# Altium project DATALOGER_final.PrjPcb (part 1 of 2)
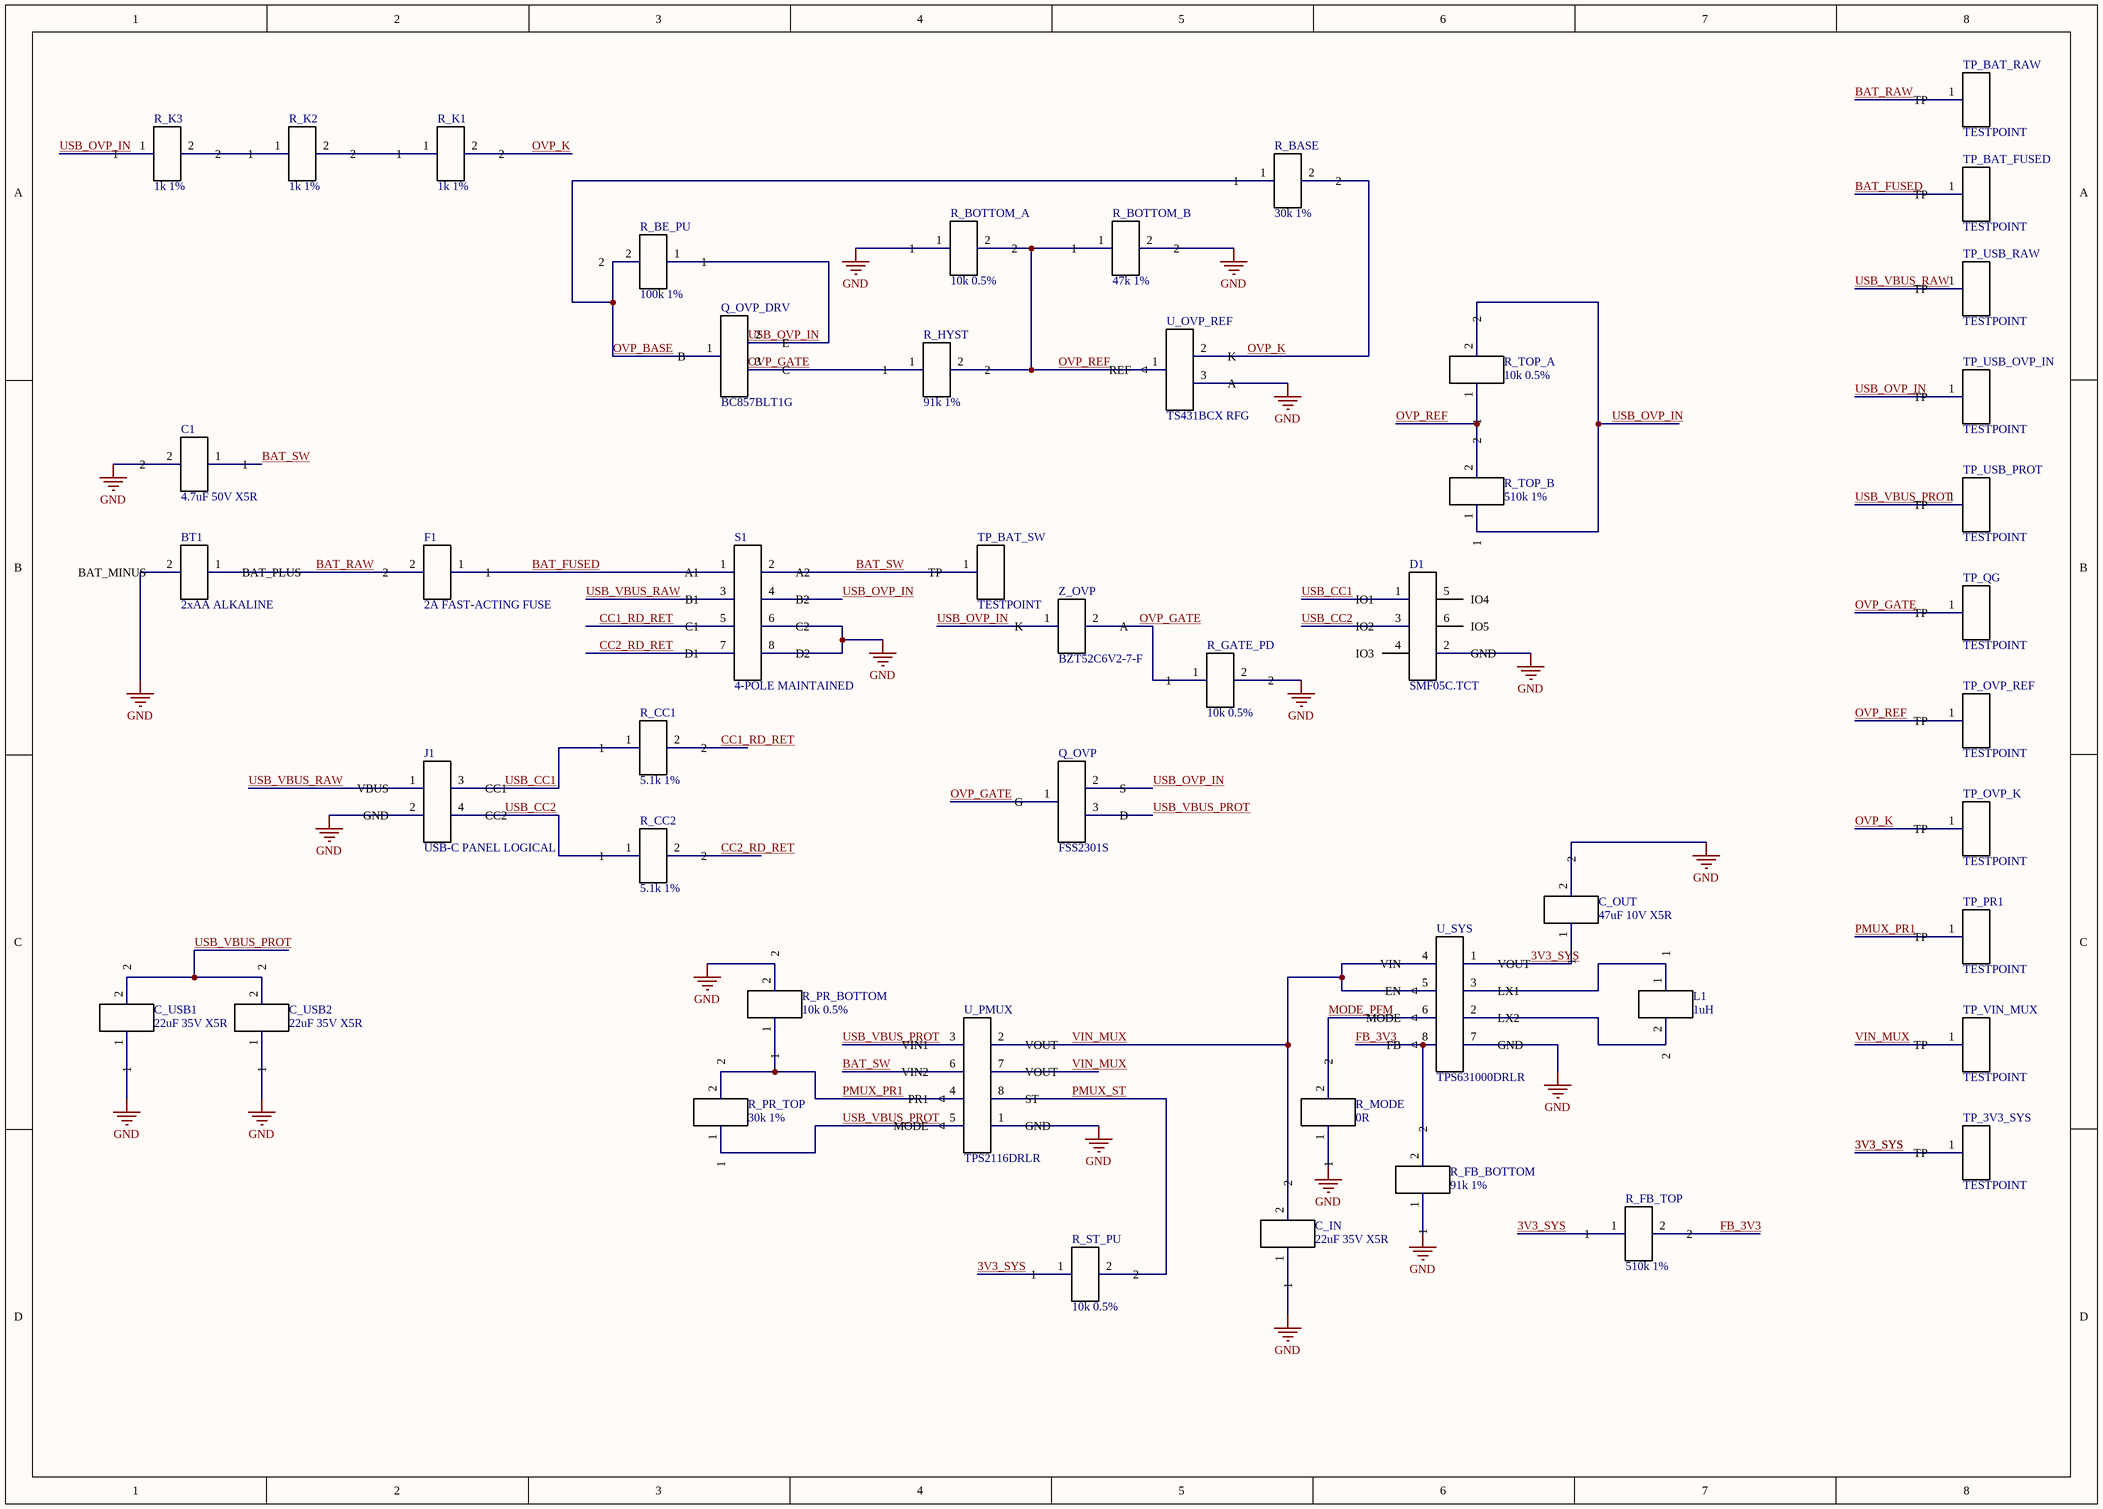
[diagram p0: 01_POWER.SchDoc]
7 sheets, 133 parts. Net scope: global (net labels, ports and power ports of the same name join across sheets).
Board file: DATALOGER_RevA.PcbDoc
Sheets:
  01_POWER.SchDoc
  02_MCU_CORE.SchDoc
  03_MICROSD.SchDoc
  04_NAVIGATION.SchDoc
  05_RTC.SchDoc
  06_OLED_SHT3X.SchDoc
  07_EXPANSION.SchDoc

## Sheet 01_POWER.SchDoc
size A3; SheetNumber: 1; SheetTotal: 7

### Parts
BT1  2xAA ALKALINE  [JST_XH_B2B_XH_A_2P_THT]
C1  4.7uF 50V X5R  [TDK_C2012_0805_CAP_2P]
C_IN  22uF 35V X5R  [TDK_C2012_0805_CAP_2P]
C_OUT  47uF 10V X5R  [TDK_C2012_0805_CAP_2P]
C_USB1  22uF 35V X5R  [TDK_C2012_0805_CAP_2P]
C_USB2  22uF 35V X5R  [TDK_C2012_0805_CAP_2P]
D1  SMF05C.TCT  [SEMTECH_SC70_6L_SMF05C]
F1  2A FAST-ACTING FUSE  [JDT_JFC2410FS_2P]
J1  USB-C PANEL LOGICAL  [JST_XH_B4B_XH_A_4P_THT]
L1  1uH  [MURATA_DFE322512F_2P]
Q_OVP  FSS2301S  [FOSAN_SOT23_FSS2301S_3P]
Q_OVP_DRV  BC857BLT1G  [ONSEMI_CASE318_SOT23_3P]
R_BASE  30k 1%  [RES_0603_SHARED_2P]
R_BE_PU  100k 1%  [RES_0603_SHARED_2P]
R_BOTTOM_A  10k 0.5%  [RES_0805_SHARED_2P]
R_BOTTOM_B  47k 1%  [RES_0603_SHARED_2P]
R_CC1  5.1k 1%  [RES_0603_SHARED_2P]
R_CC2  5.1k 1%  [RES_0603_SHARED_2P]
R_FB_BOTTOM  91k 1%  [RES_0805_SHARED_2P]
R_FB_TOP  510k 1%  [UNIROYAL_RES_1206_2P]
R_GATE_PD  10k 0.5%  [RES_0805_SHARED_2P]
R_HYST  91k 1%  [RES_0805_SHARED_2P]
R_K1  1k 1%  [RES_0805_SHARED_2P]
R_K2  1k 1%  [RES_0805_SHARED_2P]
R_K3  1k 1%  [RES_0805_SHARED_2P]
R_MODE  0R  [RES_0603_SHARED_2P]
R_PR_BOTTOM  10k 0.5%  [RES_0805_SHARED_2P]
R_PR_TOP  30k 1%  [RES_0603_SHARED_2P]
R_ST_PU  10k 0.5%  [RES_0805_SHARED_2P]
R_TOP_A  10k 0.5%  [RES_0805_SHARED_2P]
R_TOP_B  510k 1%  [UNIROYAL_RES_1206_2P]
S1  4-POLE MAINTAINED  [JST_XH_B8B_XH_A_8P_THT]
TP_3V3_SYS  TESTPOINT  [TESTPOINT_GENERIC_1P5MM]
TP_BAT_FUSED  TESTPOINT  [TESTPOINT_GENERIC_1P5MM]
TP_BAT_RAW  TESTPOINT  [TESTPOINT_GENERIC_1P5MM]
TP_BAT_SW  TESTPOINT  [TESTPOINT_GENERIC_1P5MM]
TP_OVP_K  TESTPOINT  [TESTPOINT_GENERIC_1P5MM]
TP_OVP_REF  TESTPOINT  [TESTPOINT_GENERIC_1P5MM]
TP_PR1  TESTPOINT  [TESTPOINT_GENERIC_1P5MM]
TP_QG  TESTPOINT  [TESTPOINT_GENERIC_1P5MM]
TP_USB_OVP_IN  TESTPOINT  [TESTPOINT_GENERIC_1P5MM]
TP_USB_PROT  TESTPOINT  [TESTPOINT_GENERIC_1P5MM]
TP_USB_RAW  TESTPOINT  [TESTPOINT_GENERIC_1P5MM]
TP_VIN_MUX  TESTPOINT  [TESTPOINT_GENERIC_1P5MM]
U_OVP_REF  TS431BCX RFG  [TSC_SOT23_TS431_3P]
U_PMUX  TPS2116DRLR  [TI_DRL0008A_8P]
U_SYS  TPS631000DRLR  [TI_DRL0008A_8P]
Z_OVP  BZT52C6V2-7-F  [DIODES_SOD123_2P]

### Nets
GND: BT1.2(BAT_MINUS) C1.2 C_IN.1 C_OUT.2 C_USB1.1 C_USB2.1 D1.2(GND) J1.2(GND) R_BOTTOM_A.1 R_BOTTOM_B.2 R_FB_BOTTOM.1 R_GATE_PD.2 R_MODE.1 R_PR_BOTTOM.2 S1.6(C2) S1.8(D2) U_OVP_REF.3(A) U_PMUX.1(GND) U_SYS.7(GND)
3V3_SYS: C_OUT.1 R_FB_TOP.1 R_ST_PU.1 TP_3V3_SYS.1(TP) U_SYS.1(VOUT)
BAT_FUSED: F1.1 S1.1(A1) TP_BAT_FUSED.1(TP)
BAT_RAW: BT1.1(BAT_PLUS) F1.2 TP_BAT_RAW.1(TP)
BAT_SW: C1.1 S1.2(A2) TP_BAT_SW.1(TP) U_PMUX.6(VIN2)
CC1_RD_RET: R_CC1.2 S1.5(C1)
CC2_RD_RET: R_CC2.2 S1.7(D1)
FB_3V3: R_FB_BOTTOM.2 R_FB_TOP.2 U_SYS.8(FB)
MODE_PFM: R_MODE.2 U_SYS.6(MODE)
OVP_BASE: Q_OVP_DRV.1(B) R_BASE.1 R_BE_PU.2
OVP_GATE: Q_OVP.1(G) Q_OVP_DRV.3(C) R_GATE_PD.1 R_HYST.1 TP_QG.1(TP) Z_OVP.2(A)
OVP_K: R_BASE.2 R_K1.2 TP_OVP_K.1(TP) U_OVP_REF.2(K)
OVP_REF: R_BOTTOM_A.2 R_BOTTOM_B.1 R_HYST.2 R_TOP_A.1 R_TOP_B.2 TP_OVP_REF.1(TP) U_OVP_REF.1(REF)
PMUX_PR1: R_PR_BOTTOM.1 R_PR_TOP.2 TP_PR1.1(TP) U_PMUX.4(PR1)
PMUX_ST: R_ST_PU.2 U_PMUX.8(ST)
USB_CC1: D1.1(IO1) J1.3(CC1) R_CC1.1
USB_CC2: D1.3(IO2) J1.4(CC2) R_CC2.1
USB_OVP_IN: Q_OVP.2(S) Q_OVP_DRV.2(E) R_BE_PU.1 R_K3.1 R_TOP_A.2 R_TOP_B.1 S1.4(B2) TP_USB_OVP_IN.1(TP) Z_OVP.1(K)
USB_VBUS_PROT: C_USB1.2 C_USB2.2 Q_OVP.3(D) R_PR_TOP.1 TP_USB_PROT.1(TP) U_PMUX.3(VIN1) U_PMUX.5(MODE)
USB_VBUS_RAW: J1.1(VBUS) S1.3(B1) TP_USB_RAW.1(TP)
VIN_MUX: C_IN.2 TP_VIN_MUX.1(TP) U_PMUX.2(VOUT) U_PMUX.7(VOUT) U_SYS.4(VIN) U_SYS.5(EN)
NetL1_1: L1.1 U_SYS.3(LX1)
NetL1_2: L1.2 U_SYS.2(LX2)
NetR_K1_1: R_K1.1 R_K2.2
NetR_K2_1: R_K2.1 R_K3.2

Not connected (* = marked no-connect by the designer): D1 4(IO3) 5(IO4) 6(IO5)

### Library data of the parts
BT1 = BATTERY_2XAA_OFFBOARD: Off-board two-cell AA battery holder logical interface; Manufacturer: PROJECT_LOGICAL; Source_Baseline: POWER_SCHEMATIC_ENTRY_BASELINE_v0.17_FA.txt; Qualification_Status: UNQUALIFIED_PENDING_SAVE_REOPEN_AUDIT; PIN_NUMBER_SOURCE: PROJECT_LOGICAL_DEFINITION; MPN: BATTERY_2XAA_OFFBOARD; Value: 2xAA ALKALINE; Package: LOGICAL_OFFBOARD; Datasheet: POWER_SCHEMATIC_ENTRY_BASELINE_v0.17_FA.txt; Design_Status: PROJECT_LOGICAL; PIN_FUNCTION_SOURCE: PROJECT_LOGICAL_DEFINITION
C1 = C2012X5R1H475K125AB: Battery-side local ceramic capacitor; Manufacturer: TDK; Source_Baseline: POWER_SCHEMATIC_ENTRY_BASELINE_v0.17_FA.txt; Design_Status: CONTROLLED_V0.17_P9; Qualification_Status: UNQUALIFIED_PENDING_SAVE_REOPEN_AUDIT; PIN_NUMBER_SOURCE: INTERNAL_CONVENTION; PIN_FUNCTION_SOURCE: MANUFACTURER_DATASHEET; MPN: C2012X5R1H475K125AB; Value: 4.7uF 50V X5R; Package: 0805 / 2012 metric; Datasheet: TDK exact product data C2012X5R1H475K125AB
C_IN C_USB1 C_USB2 = C2012X5R1V226M125AC: Power-path ceramic capacitor; Manufacturer: TDK; Source_Baseline: POWER_SCHEMATIC_ENTRY_BASELINE_v0.17_FA.txt; Design_Status: CONTROLLED_V0.17_P9; Qualification_Status: UNQUALIFIED_PENDING_SAVE_REOPEN_AUDIT; PIN_NUMBER_SOURCE: INTERNAL_CONVENTION; PIN_FUNCTION_SOURCE: MANUFACTURER_DATASHEET; MPN: C2012X5R1V226M125AC; Value: 22uF 35V X5R; Package: 0805 / 2012 metric; Datasheet: TDK exact product data C2012X5R1V226M125AC
C_OUT = C2012X5R1A476M125AC: 3V3 output ceramic capacitor; Manufacturer: TDK; Source_Baseline: POWER_SCHEMATIC_ENTRY_BASELINE_v0.17_FA.txt; Design_Status: CONTROLLED_V0.17_P9; Qualification_Status: UNQUALIFIED_PENDING_SAVE_REOPEN_AUDIT; PIN_NUMBER_SOURCE: INTERNAL_CONVENTION; PIN_FUNCTION_SOURCE: MANUFACTURER_DATASHEET; MPN: C2012X5R1A476M125AC; Value: 47uF 10V X5R; Package: 0805 / 2012 metric; Datasheet: TDK exact product data C2012X5R1A476M125AC
D1 = SMF05C.TCT: Five-line ESD protection array; Manufacturer: Semtech; Source_Baseline: POWER_SCHEMATIC_ENTRY_BASELINE_v0.17_FA.txt; Design_Status: CONTROLLED_V0.17; Qualification_Status: UNQUALIFIED_PENDING_SAVE_REOPEN_AUDIT; PIN_NUMBER_SOURCE: MANUFACTURER_DATASHEET; MPN: SMF05C.TCT; Value: SMF05C.TCT; Package: SC70-6; Datasheet: https://www.semtech.com/products/circuit-protection/esd-protection/smf05c; PIN_FUNCTION_SOURCE: MANUFACTURER_DATASHEET
F1 = JFC2410-1200FS: Battery input fast-acting fuse; Manufacturer: JDT Fuse; Source_Baseline: POWER_SCHEMATIC_ENTRY_BASELINE_v0.17_FA.txt; Design_Status: PROCUREMENT_LOCK_P9_PENDING; Qualification_Status: UNQUALIFIED_PENDING_SAVE_REOPEN_AUDIT; PIN_NUMBER_SOURCE: INTERNAL_CONVENTION; PIN_FUNCTION_SOURCE: MANUFACTURER_DATASHEET; MPN: JFC2410-1200FS; Value: 2A FAST-ACTING FUSE; Package: 2410 SMD; Datasheet: https://www.jdtfuse.com/upload/PDF/JFC2410FS.pdf
J1 = USB_C_PANEL_LOGICAL: Off-board USB-C panel connector logical interface; Manufacturer: PROJECT_LOGICAL; Source_Baseline: POWER_SCHEMATIC_ENTRY_BASELINE_v0.17_FA.txt; Qualification_Status: UNQUALIFIED_PENDING_SAVE_REOPEN_AUDIT; PIN_NUMBER_SOURCE: PROJECT_LOGICAL_DEFINITION; MPN: USB_C_PANEL_LOGICAL; Value: USB-C PANEL LOGICAL; Package: LOGICAL_OFFBOARD; Datasheet: POWER_SCHEMATIC_ENTRY_BASELINE_v0.17_FA.txt; Design_Status: PROJECT_LOGICAL; PIN_FUNCTION_SOURCE: PROJECT_LOGICAL_DEFINITION
L1 = DFE322512F-1R0M=P2: Shielded power inductor; Manufacturer: Murata; Source_Baseline: POWER_SCHEMATIC_ENTRY_BASELINE_v0.17_FA.txt; Design_Status: DESIGN_LOCK_V0.17_P9_PENDING; Qualification_Status: UNQUALIFIED_PENDING_SAVE_REOPEN_AUDIT; PIN_NUMBER_SOURCE: INTERNAL_CONVENTION; PIN_FUNCTION_SOURCE: MANUFACTURER_DATASHEET; MPN: DFE322512F-1R0M=P2; Value: 1uH; Package: DFE3225; Datasheet: Murata DFE322512F product data
Q_OVP = FSS2301S: -20V P-channel enhancement MOSFET used as USB OVP switch; Manufacturer: FOSAN; Source_Baseline: POWER_SCHEMATIC_ENTRY_BASELINE_v0.17_FA.txt; Design_Status: CONTROLLED_V0.17_P9; Qualification_Status: UNQUALIFIED_PENDING_SAVE_REOPEN_AUDIT; PIN_NUMBER_SOURCE: INTERNAL_CONVENTION; PIN_FUNCTION_SOURCE: MANUFACTURER_DATASHEET; MPN: FSS2301S; Value: FSS2301S; Package: SOT-23; Datasheet: FSS2301S_FOSAN_Official.pdf
Q_OVP_DRV = BC857BLT1G: PNP transistor used as OVP gate driver; Manufacturer: onsemi; Source_Baseline: POWER_SCHEMATIC_ENTRY_BASELINE_v0.17_FA.txt; Design_Status: CONTROLLED_V0.17_P9; Qualification_Status: UNQUALIFIED_PENDING_SAVE_REOPEN_AUDIT; PIN_NUMBER_SOURCE: MANUFACTURER_DATASHEET; MPN: BC857BLT1G; Value: BC857BLT1G; Package: SOT-23 / TO-236; Datasheet: onsemi BC856/BC857/BC858 manufacturer datasheet; PIN_FUNCTION_SOURCE: MANUFACTURER_DATASHEET
R_BASE R_PR_TOP = 0603WAF3002T5E: Power network resistor; Manufacturer: UNI-ROYAL; Source_Baseline: POWER_SCHEMATIC_ENTRY_BASELINE_v0.17_FA.txt; Design_Status: DESIGN_LOCK_V0.17; Qualification_Status: UNQUALIFIED_PENDING_SAVE_REOPEN_AUDIT; PIN_NUMBER_SOURCE: INTERNAL_CONVENTION; PIN_FUNCTION_SOURCE: MANUFACTURER_DATASHEET; MPN: 0603WAF3002T5E; Value: 30k 1%; Package: 0603; Datasheet: UNI-ROYAL manufacturer resistor data
R_BE_PU = 0603WAF1003T5E: OVP resistor; Manufacturer: UNI-ROYAL; Source_Baseline: POWER_SCHEMATIC_ENTRY_BASELINE_v0.17_FA.txt; Design_Status: CONTROLLED_V0.17_P9; Qualification_Status: UNQUALIFIED_PENDING_SAVE_REOPEN_AUDIT; PIN_NUMBER_SOURCE: INTERNAL_CONVENTION; PIN_FUNCTION_SOURCE: MANUFACTURER_DATASHEET; MPN: 0603WAF1003T5E; Value: 100k 1%; Package: 0603; Datasheet: UNI-ROYAL manufacturer resistor data
R_BOTTOM_A R_GATE_PD R_PR_BOTTOM R_ST_PU R_TOP_A = ARG05DTC1002: Precision power network resistor; Manufacturer: Viking Tech; Source_Baseline: POWER_SCHEMATIC_ENTRY_BASELINE_v0.17_FA.txt; Design_Status: DESIGN_LOCK_V0.17; Qualification_Status: UNQUALIFIED_PENDING_SAVE_REOPEN_AUDIT; PIN_NUMBER_SOURCE: INTERNAL_CONVENTION; PIN_FUNCTION_SOURCE: MANUFACTURER_DATASHEET; MPN: ARG05DTC1002; Value: 10k 0.5%; Package: 0805 / ARG05; Datasheet: Viking Tech AR series product data
R_BOTTOM_B = 0603WAF4702T5E: OVP resistor; Manufacturer: UNI-ROYAL; Source_Baseline: POWER_SCHEMATIC_ENTRY_BASELINE_v0.17_FA.txt; Design_Status: CONTROLLED_V0.17_P9; Qualification_Status: UNQUALIFIED_PENDING_SAVE_REOPEN_AUDIT; PIN_NUMBER_SOURCE: INTERNAL_CONVENTION; PIN_FUNCTION_SOURCE: MANUFACTURER_DATASHEET; MPN: 0603WAF4702T5E; Value: 47k 1%; Package: 0603; Datasheet: UNI-ROYAL manufacturer resistor data
R_CC1 R_CC2 = FRC0603F5101TS: USB-C Rd resistor; Manufacturer: FOJAN / FOSAN Technology; Source_Baseline: POWER_SCHEMATIC_ENTRY_BASELINE_v0.17_FA.txt; Design_Status: DESIGN_LOCK_V0.17; Qualification_Status: UNQUALIFIED_PENDING_SAVE_REOPEN_AUDIT; PIN_NUMBER_SOURCE: INTERNAL_CONVENTION; PIN_FUNCTION_SOURCE: MANUFACTURER_DATASHEET; MPN: FRC0603F5101TS; Value: 5.1k 1%; Package: 0603; Datasheet: FRC0603F5101TS-UniOhm.pdf / FOSAN FRC Series FJ-JS-3001-V3.0
R_FB_BOTTOM R_HYST = 0805W8F9102T5E: Power feedback/hysteresis resistor; Manufacturer: UNI-ROYAL; Source_Baseline: POWER_SCHEMATIC_ENTRY_BASELINE_v0.17_FA.txt; Design_Status: DESIGN_LOCK_V0.17; Qualification_Status: UNQUALIFIED_PENDING_SAVE_REOPEN_AUDIT; PIN_NUMBER_SOURCE: INTERNAL_CONVENTION; PIN_FUNCTION_SOURCE: MANUFACTURER_DATASHEET; MPN: 0805W8F9102T5E; Value: 91k 1%; Package: 0805; Datasheet: UNI-ROYAL manufacturer resistor data
R_FB_TOP R_TOP_B = 1206W4F5103T5E: Power feedback resistor; Manufacturer: UNI-ROYAL; Source_Baseline: POWER_SCHEMATIC_ENTRY_BASELINE_v0.17_FA.txt; Design_Status: DESIGN_LOCK_V0.17; Qualification_Status: UNQUALIFIED_PENDING_SAVE_REOPEN_AUDIT; PIN_NUMBER_SOURCE: INTERNAL_CONVENTION; PIN_FUNCTION_SOURCE: MANUFACTURER_DATASHEET; MPN: 1206W4F5103T5E; Value: 510k 1%; Package: 1206; Datasheet: UNI-ROYAL manufacturer resistor data
R_K1-R_K3 = 0805W8F1001T5E: OVP series resistor; Manufacturer: UNI-ROYAL; Source_Baseline: POWER_SCHEMATIC_ENTRY_BASELINE_v0.17_FA.txt; Design_Status: CONTROLLED_V0.17_P9; Qualification_Status: UNQUALIFIED_PENDING_SAVE_REOPEN_AUDIT; PIN_NUMBER_SOURCE: INTERNAL_CONVENTION; PIN_FUNCTION_SOURCE: MANUFACTURER_DATASHEET; MPN: 0805W8F1001T5E; Value: 1k 1%; Package: 0805; Datasheet: UNI-ROYAL manufacturer resistor data
R_MODE = SER0603J0R: Zero-ohm mode strap; Manufacturer: VICO / Anhui Xiangsheng Technology; Source_Baseline: POWER_SCHEMATIC_ENTRY_BASELINE_v0.17_FA.txt; Design_Status: DESIGN_LOCK_V0.17; Qualification_Status: UNQUALIFIED_PENDING_SAVE_REOPEN_AUDIT; PIN_NUMBER_SOURCE: INTERNAL_CONVENTION; PIN_FUNCTION_SOURCE: MANUFACTURER_DATASHEET; MPN: SER0603J0R; Value: 0R; Package: 0603; Datasheet: SER0603J0R-VO-Sub-Brand-(ER).pdf
S1 = S1_4POLE_MAINTAINED_OFFBOARD: Four independent maintained off-board switch contacts; Manufacturer: PROJECT_LOGICAL; Source_Baseline: POWER_SCHEMATIC_ENTRY_BASELINE_v0.17_FA.txt; Design_Status: PROJECT_LOGICAL_MECH_HOLD; Qualification_Status: UNQUALIFIED_PENDING_SAVE_REOPEN_AUDIT; PIN_NUMBER_SOURCE: PROJECT_LOGICAL_DEFINITION; MPN: S1_4POLE_MAINTAINED_OFFBOARD; Value: 4-POLE MAINTAINED; Package: LOGICAL_OFFBOARD; Datasheet: POWER_SCHEMATIC_ENTRY_BASELINE_v0.17_FA.txt; PIN_FUNCTION_SOURCE: PROJECT_LOGICAL_DEFINITION
TP_3V3_SYS TP_BAT_FUSED TP_BAT_RAW TP_BAT_SW TP_OVP_K TP_OVP_REF TP_PR1 TP_QG TP_USB_OVP_IN TP_USB_PROT TP_USB_RAW TP_VIN_MUX = TESTPOINT_GENERIC: Generic schematic test point; Manufacturer: PROJECT_LOGICAL; Source_Baseline: POWER_SCHEMATIC_ENTRY_BASELINE_v0.17_FA.txt; Qualification_Status: UNQUALIFIED_PENDING_SAVE_REOPEN_AUDIT; PIN_NUMBER_SOURCE: PROJECT_LOGICAL_DEFINITION; MPN: TESTPOINT_GENERIC; Value: TESTPOINT; Package: LOGICAL; Datasheet: POWER_SCHEMATIC_ENTRY_BASELINE_v0.17_FA.txt; Design_Status: PROJECT_LOGICAL; PIN_FUNCTION_SOURCE: PROJECT_LOGICAL_DEFINITION
U_OVP_REF = TS431BCX RFG: Programmable shunt reference, B grade; Manufacturer: Taiwan Semiconductor; Source_Baseline: POWER_SCHEMATIC_ENTRY_BASELINE_v0.17_FA.txt; Design_Status: CONTROLLED_V0.17_P9; Qualification_Status: UNQUALIFIED_PENDING_SAVE_REOPEN_AUDIT; PIN_NUMBER_SOURCE: MANUFACTURER_DATASHEET; MPN: TS431BCX RFG; Value: TS431BCX RFG; Package: SOT-23; Datasheet: https://services.taiwansemi.com/storage/resources/datasheet/TS431_K2412.pdf; PIN_FUNCTION_SOURCE: MANUFACTURER_DATASHEET
U_PMUX = TPS2116DRLR: Power multiplexer with priority control; Manufacturer: Texas Instruments; Source_Baseline: POWER_SCHEMATIC_ENTRY_BASELINE_v0.17_FA.txt; Design_Status: CONTROLLED_V0.17_P9; Qualification_Status: UNQUALIFIED_PENDING_SAVE_REOPEN_AUDIT; PIN_NUMBER_SOURCE: MANUFACTURER_DATASHEET; MPN: TPS2116DRLR; Value: TPS2116DRLR; Package: DRL / SOT-5X3-8; Datasheet: https://www.ti.com/lit/ds/symlink/tps2116.pdf; PIN_FUNCTION_SOURCE: MANUFACTURER_DATASHEET
U_SYS = TPS631000DRLR: 3.3V system buck-boost converter; Manufacturer: Texas Instruments; Source_Baseline: POWER_SCHEMATIC_ENTRY_BASELINE_v0.17_FA.txt; Design_Status: DESIGN_LOCK_V0.17_P9_PENDING; Qualification_Status: UNQUALIFIED_PENDING_SAVE_REOPEN_AUDIT; PIN_NUMBER_SOURCE: MANUFACTURER_DATASHEET; MPN: TPS631000DRLR; Value: TPS631000DRLR; Package: DRL / SOT-5X3-8; Datasheet: https://www.ti.com/lit/ds/symlink/tps631000.pdf; PIN_FUNCTION_SOURCE: MANUFACTURER_DATASHEET
Z_OVP = BZT52C6V2-7-F: 6.2V zener gate-source clamp; Manufacturer: Diodes Incorporated; Source_Baseline: POWER_SCHEMATIC_ENTRY_BASELINE_v0.17_FA.txt; Design_Status: CONTROLLED_V0.17_P9; Qualification_Status: UNQUALIFIED_PENDING_SAVE_REOPEN_AUDIT; PIN_NUMBER_SOURCE: INTERNAL_CONVENTION; PIN_FUNCTION_SOURCE: MANUFACTURER_DATASHEET; MPN: BZT52C6V2-7-F; Value: BZT52C6V2-7-F; Package: SOD-123; Datasheet: https://www.diodes.com/datasheet/download/BZT52Cxx.pdf

## Sheet 02_MCU_CORE.SchDoc
size A3; SheetNumber: 2; SheetTotal: 7
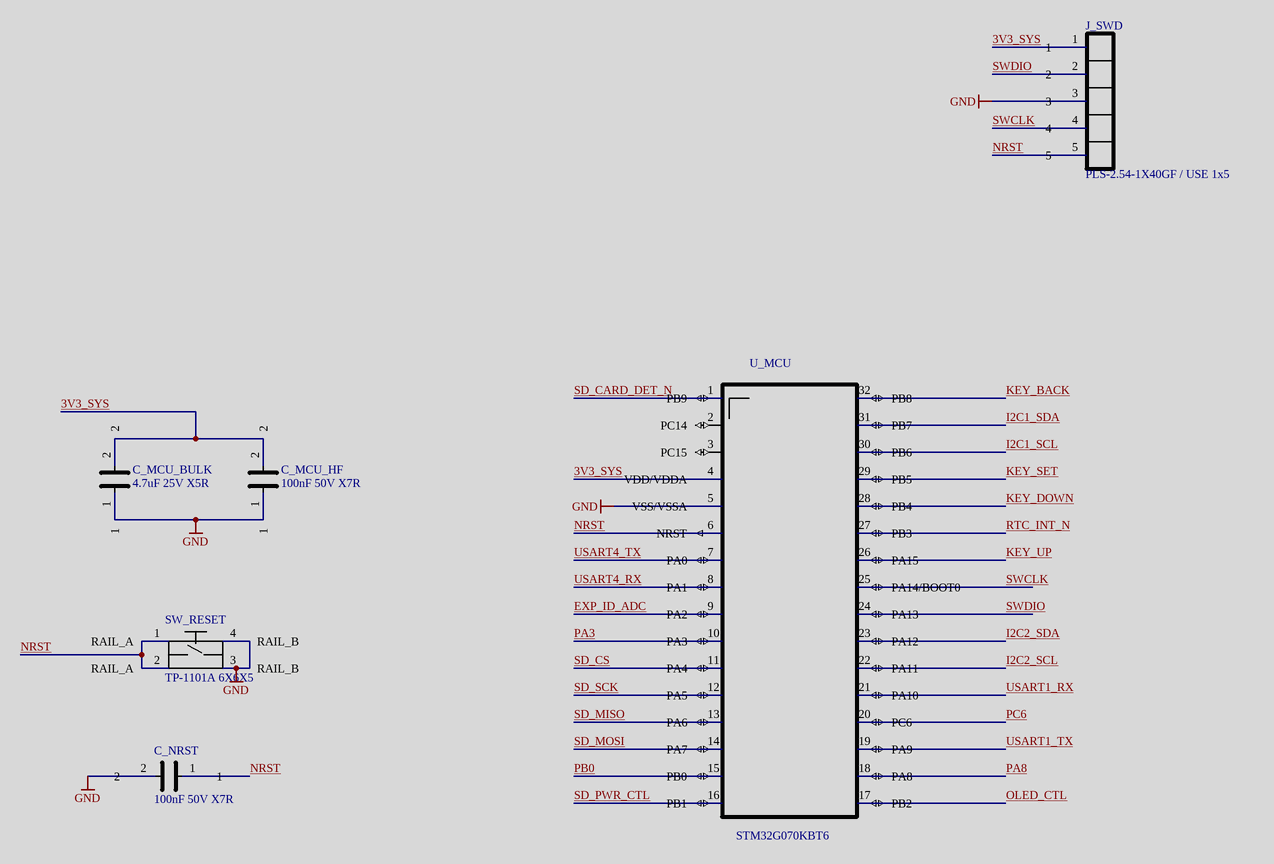
[diagram p1: 02_MCU_CORE.SchDoc]

### Parts
C_MCU_BULK  4.7uF 25V X5R  [TDK_C2012_0805_REFLOW_2P]
C_MCU_HF  100nF 50V X7R  [SAMSUNG_CL10_0603_CAP_2P]
C_NRST  100nF 50V X7R  [SAMSUNG_CL10_0603_CAP_2P]
J_SWD  PLS-2.54-1X40GF / USE 1x5  [GOSUN_PLS_2P54_1X5_THT]
SW_RESET  TP-1101A 6X6X5  [TACT_6X6_H5_P6P5_X4P5_4P_THT_REV_A]
U_MCU  STM32G070KBT6  [ST_LQFP32_7X7_P0P8_32P]

### Nets
GND: C_MCU_BULK.1 C_MCU_HF.1 C_NRST.2 J_SWD.3 SW_RESET.3(RAIL_B) SW_RESET.4(RAIL_B) U_MCU.5(VSS/VSSA)
3V3_SYS: C_MCU_BULK.2 C_MCU_HF.2 J_SWD.1 U_MCU.4(VDD/VDDA)
EXP_ID_ADC: U_MCU.9(PA2)
I2C1_SCL: U_MCU.30(PB6)
I2C1_SDA: U_MCU.31(PB7)
I2C2_SCL: U_MCU.22(PA11)
I2C2_SDA: U_MCU.23(PA12)
KEY_BACK: U_MCU.32(PB8)
KEY_DOWN: U_MCU.28(PB4)
KEY_SET: U_MCU.29(PB5)
KEY_UP: U_MCU.26(PA15)
NRST: C_NRST.1 J_SWD.5 SW_RESET.1(RAIL_A) SW_RESET.2(RAIL_A) U_MCU.6(NRST)
OLED_CTL: U_MCU.17(PB2)
PA3: U_MCU.10(PA3)
PA8: U_MCU.18(PA8)
PB0: U_MCU.15(PB0)
PC6: U_MCU.20(PC6)
RTC_INT_N: U_MCU.27(PB3)
SD_CARD_DET_N: U_MCU.1(PB9)
SD_CS: U_MCU.11(PA4)
SD_MISO: U_MCU.13(PA6)
SD_MOSI: U_MCU.14(PA7)
SD_PWR_CTL: U_MCU.16(PB1)
SD_SCK: U_MCU.12(PA5)
SWCLK: J_SWD.4 U_MCU.25(PA14/BOOT0)
SWDIO: J_SWD.2 U_MCU.24(PA13)
USART1_RX: U_MCU.21(PA10)
USART1_TX: U_MCU.19(PA9)
USART4_RX: U_MCU.8(PA1)
USART4_TX: U_MCU.7(PA0)

Not connected (* = marked no-connect by the designer): U_MCU 2(PC14) 3(PC15)

### Library data of the parts
C_MCU_BULK = C2012X5R1E475K125AB: MCU-core ceramic capacitor; Manufacturer: TDK; Source_Baseline: MCU_SCHEMATIC_ENTRY_BASELINE_v2.1_FA.txt; Design_Status: DESIGN_LOCK_MCU_CORE_V2.1_REUSE_G009_PENDING_LINK; Qualification_Status: UNQUALIFIED_PENDING_SAVE_REOPEN_AUDIT; PIN_NUMBER_SOURCE: INTERNAL_CONVENTION; PIN_FUNCTION_SOURCE: MANUFACTURER_DATASHEET; MPN: C2012X5R1E475K125AB; Value: 4.7uF 25V X5R; Package: C2012 / EIA 0805; Datasheet: https://product.tdk.com/en/search/capacitor/ceramic/mlcc/info?part_no=C2012X5R1E475K125AB
C_MCU_HF C_NRST = CL10B104KB8NNNC: MCU-core ceramic capacitor; Manufacturer: Samsung Electro-Mechanics; Source_Baseline: MCU_SCHEMATIC_ENTRY_BASELINE_v2.1_FA.txt; Design_Status: DESIGN_LOCK_MCU_CORE_V2.1_FOOTPRINT_HOLD; Qualification_Status: UNQUALIFIED_PENDING_SAVE_REOPEN_AUDIT; PIN_NUMBER_SOURCE: INTERNAL_CONVENTION; PIN_FUNCTION_SOURCE: MANUFACTURER_DATASHEET; MPN: CL10B104KB8NNNC; Value: 100nF 50V X7R; Package: 0603 / 1608 metric; Datasheet: https://product.samsungsem.com/mlcc/CL10B104KB8NNN.do
J_SWD = PLS-2.54-1X40GF: 1x40 2.54 mm stock strip; five positions used for SWD service header; Manufacturer: NINGBO GOSUN TECHNOLOGY CO.,LTD; Source_Baseline: MCU_SCHEMATIC_ENTRY_BASELINE_v2.1_FA.txt; Design_Status: DESIGN_LOCK_MCU_CORE_V2.1_MECHANICAL_HOLD; Qualification_Status: UNQUALIFIED_PENDING_SAVE_REOPEN_AUDIT; PIN_NUMBER_SOURCE: INTERNAL_CONVENTION; PIN_FUNCTION_SOURCE: MCU_CORE_V2.1_PROJECT_MAPPING; MPN: PLS-2.54-1X40GF; Value: PLS-2.54-1X40GF / USE 1x5; Package: 2.54 mm single-row pin header stock strip; Datasheet: Manufacturer PLS series ordering code; mechanical drawing still controlled HOLD
SW_RESET = TP-1101A_6X6X5_THT: Generic TP-1101A-compatible momentary SPST-NO tactile switch; 6x6x5 mm; four-pin THT; sample fit pending; Manufacturer: MULTISOURCE; MPN: TP-1101A_COMPATIBLE_6X6X5; Value: TACT SWITCH 6X6X5; Source_Baseline: Datalogger Rev-A post-BT2 controlled library, user-confirmed 2026-09-03; Design_Status: T23_CONTROLLED_ADDITIVE_DELTA; Qualification_Status: SAMPLE_FIT_PENDING; PIN_NUMBER_SOURCE: OMRON_B3F_REFERENCE_TOP_VIEW; PIN_FUNCTION_SOURCE: RAIL_A_1_2_RAIL_B_3_4; Package: 6x6x5 mm THT 4-pin; PCB pitch 6.5x4.5 mm; Datasheet: Omron B3F 6x6 THT geometry reference; procurement sample controls final fit
U_MCU = STM32G070KBT6: Main MCU for Datalogger Rev-A; controlled 32-pin package map; Manufacturer: STMicroelectronics; Source_Baseline: MCU_SCHEMATIC_ENTRY_BASELINE_v2.1_FA.txt; Design_Status: DESIGN_LOCK_MCU_CORE_V2.1; Qualification_Status: UNQUALIFIED_PENDING_SAVE_REOPEN_AUDIT; PIN_NUMBER_SOURCE: MANUFACTURER_DATASHEET; MPN: STM32G070KBT6; Value: STM32G070KBT6; Package: LQFP32 7x7 mm P0.8; Datasheet: https://www.st.com/resource/en/datasheet/stm32g070kb.pdf; PIN_FUNCTION_SOURCE: MANUFACTURER_DATASHEET

## Sheet 03_MICROSD.SchDoc
size A3; SheetNumber: 3; SheetTotal: 7
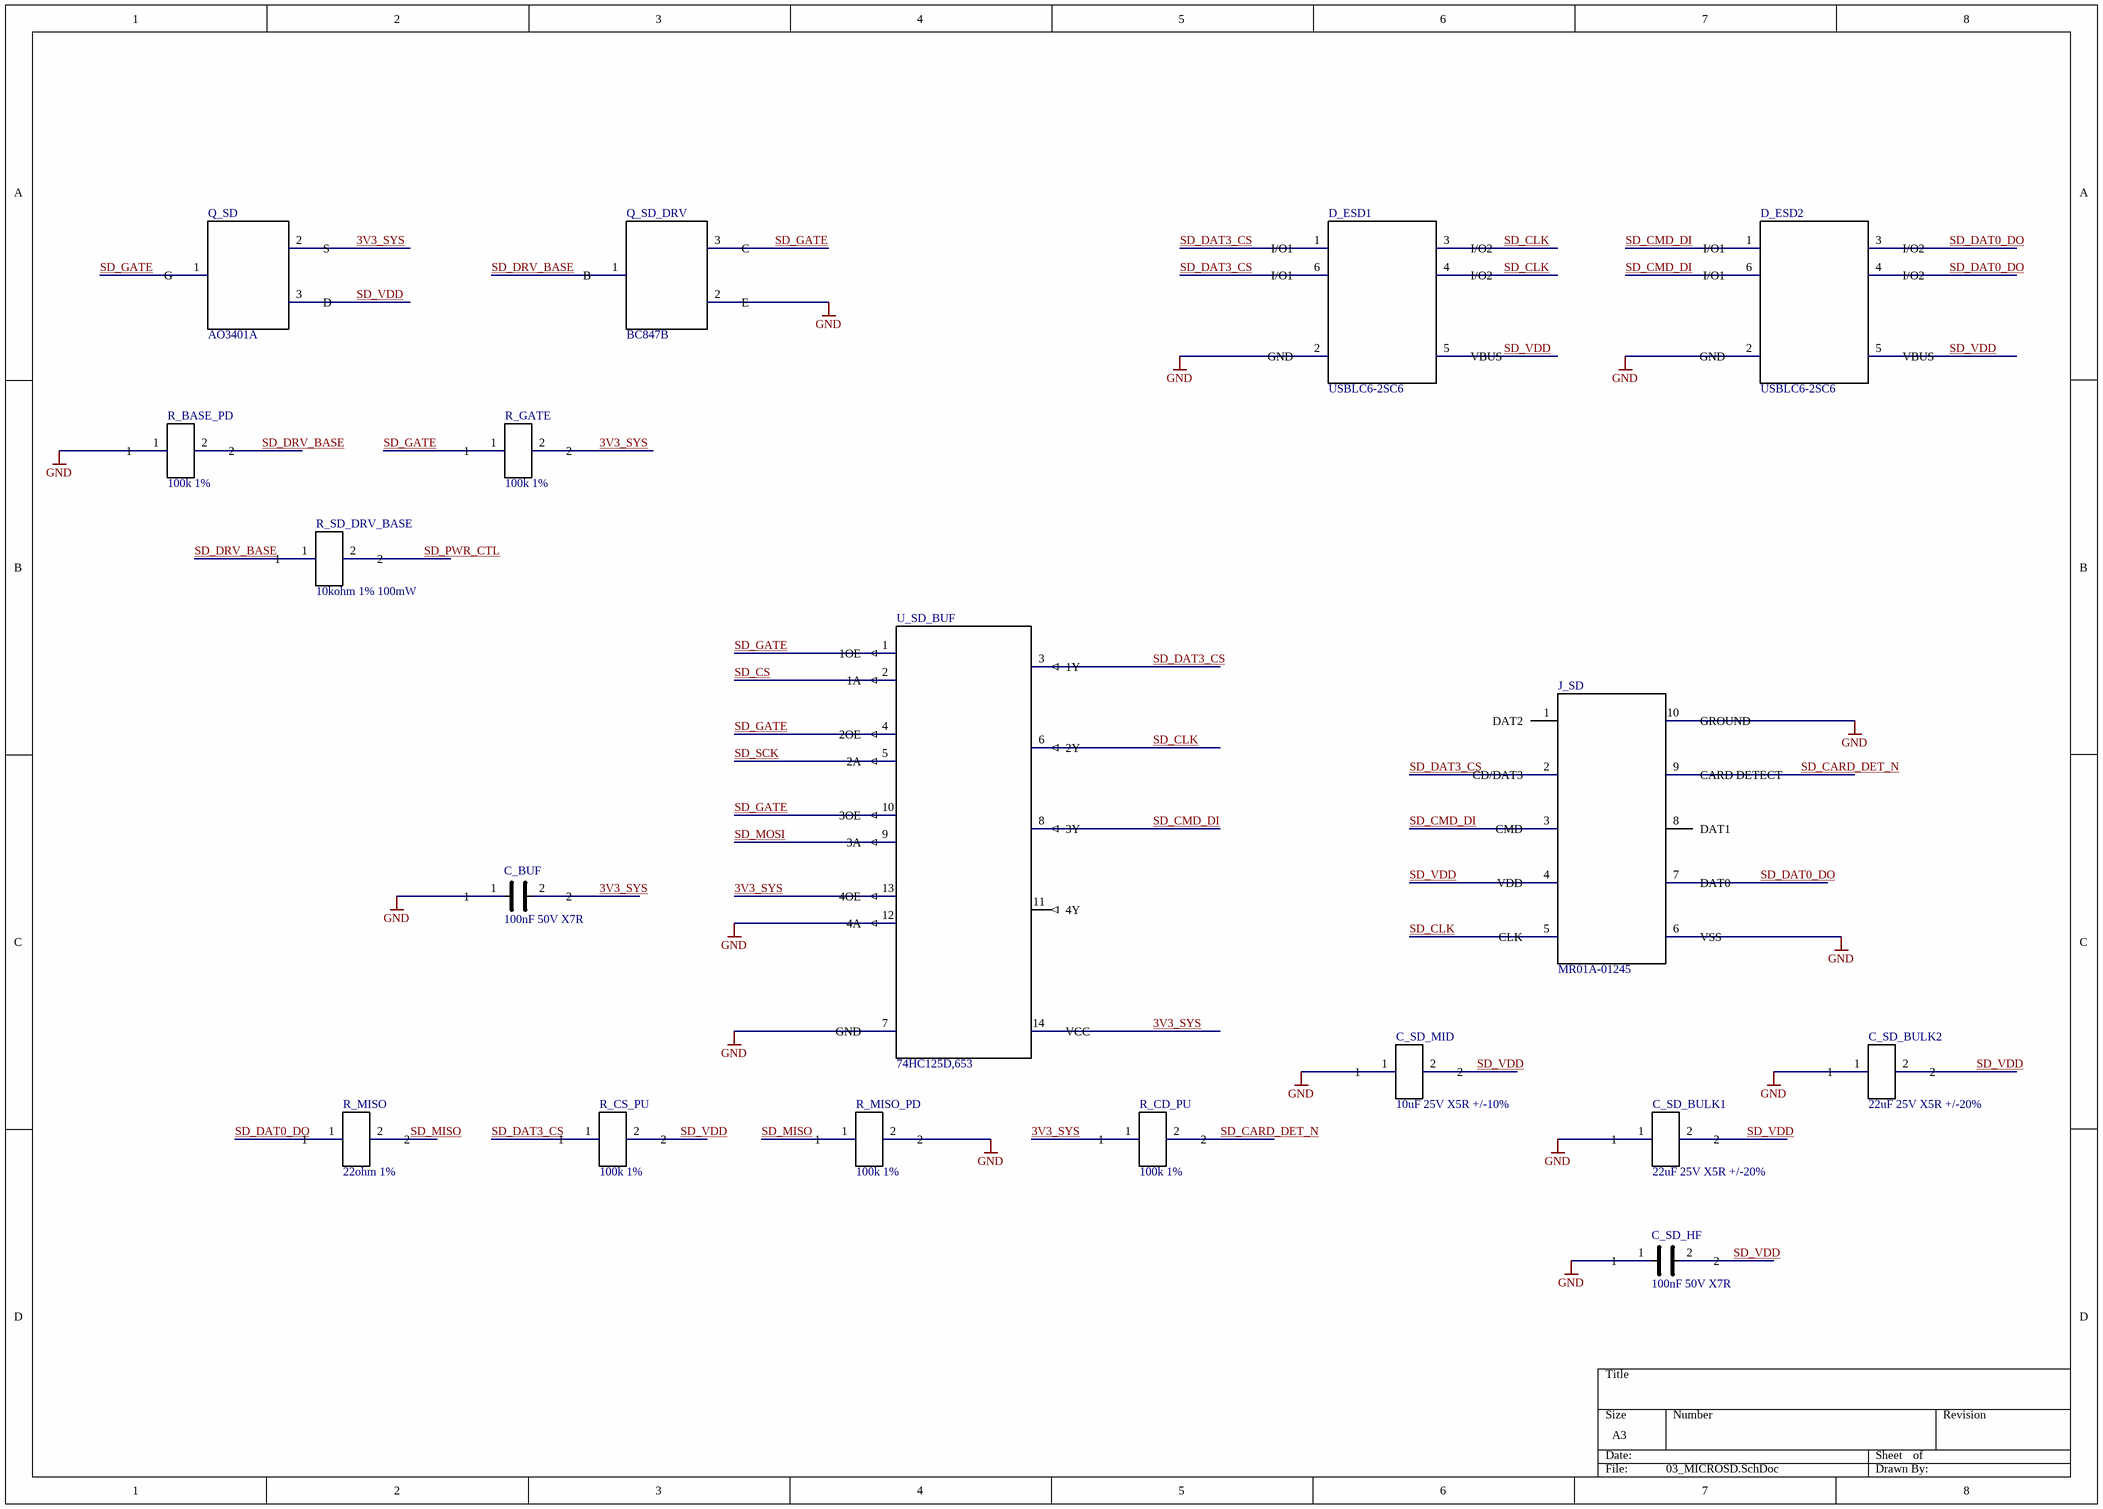
[diagram p2: 03_MICROSD.SchDoc]

### Parts
C_BUF  100nF 50V X7R  [SAMSUNG_CL10_0603_CAP_2P]
C_SD_BULK1  22uF 25V X5R +/-20%  [TDK_C2012_0805_REFLOW_2P]
C_SD_BULK2  22uF 25V X5R +/-20%  [TDK_C2012_0805_REFLOW_2P]
C_SD_HF  100nF 50V X7R  [SAMSUNG_CL10_0603_CAP_2P]
C_SD_MID  10uF 25V X5R +/-10%  [MURATA_GRM21_0805_CAP_2P]
D_ESD1  USBLC6-2SC6  [ST_SOT23_6L_USBLC6_6P]
D_ESD2  USBLC6-2SC6  [ST_SOT23_6L_USBLC6_6P]
J_SD  MR01A-01245  [ATOM_MR01A_01245_10P]
Q_SD  AO3401A  [AOS_SOT23_AO3401A_3P]
Q_SD_DRV  BC847B  [NEXPERIA_SOT23_TO236AB_3P]
R_BASE_PD  100k 1%  [RES_0603_SHARED_2P]
R_CD_PU  100k 1%  [RES_0603_SHARED_2P]
R_CS_PU  100k 1%  [RES_0603_SHARED_2P]
R_GATE  100k 1%  [RES_0603_SHARED_2P]
R_MISO  22ohm 1%  [RES_0603_SHARED_2P]
R_MISO_PD  100k 1%  [RES_0603_SHARED_2P]
R_SD_DRV_BASE  10kohm 1% 100mW  [RES_0603_SHARED_2P]
U_SD_BUF  74HC125D,653  [NEXPERIA_SOT108_1_SO14_14P]

### Nets
GND: C_BUF.1 C_SD_BULK1.1 C_SD_BULK2.1 C_SD_HF.1 C_SD_MID.1 D_ESD1.2(GND) D_ESD2.2(GND) J_SD.6(VSS) J_SD.10(GROUND) Q_SD_DRV.2(E) R_BASE_PD.1 R_MISO_PD.2 U_SD_BUF.7(GND) U_SD_BUF.12(4A)
3V3_SYS: C_BUF.2 Q_SD.2(S) R_CD_PU.1 R_GATE.2 U_SD_BUF.13(4OE) U_SD_BUF.14(VCC)
SD_CARD_DET_N: J_SD.9(CARD_DETECT) R_CD_PU.2
SD_CLK: D_ESD1.3(I/O2) D_ESD1.4(I/O2) J_SD.5(CLK) U_SD_BUF.6(2Y)
SD_CMD_DI: D_ESD2.1(I/O1) D_ESD2.6(I/O1) J_SD.3(CMD) U_SD_BUF.8(3Y)
SD_CS: U_SD_BUF.2(1A)
SD_DAT0_DO: D_ESD2.3(I/O2) D_ESD2.4(I/O2) J_SD.7(DAT0) R_MISO.1
SD_DAT3_CS: D_ESD1.1(I/O1) D_ESD1.6(I/O1) J_SD.2(CD/DAT3) R_CS_PU.1 U_SD_BUF.3(1Y)
SD_DRV_BASE: Q_SD_DRV.1(B) R_BASE_PD.2 R_SD_DRV_BASE.1
SD_GATE: Q_SD.1(G) Q_SD_DRV.3(C) R_GATE.1 U_SD_BUF.1(1OE) U_SD_BUF.4(2OE) U_SD_BUF.10(3OE)
SD_MISO: R_MISO.2 R_MISO_PD.1
SD_MOSI: U_SD_BUF.9(3A)
SD_PWR_CTL: R_SD_DRV_BASE.2
SD_SCK: U_SD_BUF.5(2A)
SD_VDD: C_SD_BULK1.2 C_SD_BULK2.2 C_SD_HF.2 C_SD_MID.2 D_ESD1.5(VBUS) D_ESD2.5(VBUS) J_SD.4(VDD) Q_SD.3(D) R_CS_PU.2

Not connected (* = marked no-connect by the designer): J_SD 1(DAT2) 8(DAT1); U_SD_BUF 11(4Y)

### Library data of the parts
C_BUF C_SD_HF = CL10B104KB8NNNC: as C_MCU_HF on sheet 02_MCU_CORE; MPN: CL10B104KB8NNNC; Value: 100nF 50V X7R; Package: 0603 / 1608 metric; Datasheet: https://product.samsungsem.com/mlcc/CL10B104KB8NNN.do
C_SD_BULK1 C_SD_BULK2 = C2012X5R1E226M125AC: MicroSD local bulk ceramic capacitor; Manufacturer: TDK; Source_Baseline: MICROSD_SCHEMATIC_ENTRY_BASELINE_v1.2_FA.txt; Design_Status: DESIGN_LOCK_MICROSD_V1.2_REUSE_CANDIDATE_PENDING_LINK; Qualification_Status: UNQUALIFIED_PENDING_SAVE_REOPEN_AUDIT; PIN_NUMBER_SOURCE: INTERNAL_CONVENTION_1_2; PIN_FUNCTION_SOURCE: MANUFACTURER_PRODUCT_DATA; MPN: C2012X5R1E226M125AC; Value: 22uF 25V X5R +/-20%; Package: C2012 / EIA 0805; Datasheet: https://product.tdk.com/en/search/capacitor/ceramic/mlcc/info?part_no=C2012X5R1E226M125AC
C_SD_MID = GRM21BR61E106KA73L: MicroSD local mid-value ceramic capacitor; Manufacturer: Murata Manufacturing; Source_Baseline: MICROSD_SCHEMATIC_ENTRY_BASELINE_v1.2_FA.txt; Design_Status: DESIGN_LOCK_MICROSD_V1.2_FOOTPRINT_COMPARE_PENDING; Qualification_Status: UNQUALIFIED_PENDING_SAVE_REOPEN_AUDIT; PIN_NUMBER_SOURCE: INTERNAL_CONVENTION_1_2; PIN_FUNCTION_SOURCE: MANUFACTURER_PRODUCT_DATA; MPN: GRM21BR61E106KA73L; Value: 10uF 25V X5R +/-10%; Package: 2012M / EIA 0805; Datasheet: https://pim.murata.com/en-global/pim/details/?partNum=GRM21BR61E106KA73%23
D_ESD1 D_ESD2 = USBLC6-2SC6: Two-line low-capacitance ESD protector; ST device purchased for Rev-A; Manufacturer: STMicroelectronics; Source_Baseline: MICROSD_SCHEMATIC_ENTRY_BASELINE_v1.2_FA.txt; Design_Status: DESIGN_LOCK_MICROSD_V1.2_ST_PROCUREMENT; Qualification_Status: UNQUALIFIED_PENDING_SAVE_REOPEN_AUDIT; PIN_NUMBER_SOURCE: MANUFACTURER_DATASHEET; MPN: USBLC6-2SC6; Value: USBLC6-2SC6; Package: SOT23-6L; Datasheet: https://www.st.com/resource/en/datasheet/usblc6-2.pdf; PIN_FUNCTION_SOURCE: MANUFACTURER_DATASHEET
J_SD = MR01A-01245: microSD socket with card detect; pin table controlled by ATOM-A10248 Rev A0; Manufacturer: Shenzhen ATOM Technology; Source_Baseline: MICROSD_SCHEMATIC_ENTRY_BASELINE_v1.2_FA.txt; Design_Status: DESIGN_LOCK_MICROSD_V1.2_SOCKET_DRAWING; Qualification_Status: UNQUALIFIED_PENDING_SAVE_REOPEN_AUDIT; PIN_NUMBER_SOURCE: MANUFACTURER_DRAWING; MPN: MR01A-01245; Value: MR01A-01245; Package: Right-angle SMD/SMT microSD socket; Datasheet: ATOM-A10248 Rev A0 controlled local manufacturer drawing; PIN_FUNCTION_SOURCE: MANUFACTURER_DRAWING
Q_SD = AO3401A: -30V P-channel MOSFET used as switched SD_VDD high-side pass element; Manufacturer: Alpha & Omega Semiconductor; Source_Baseline: MICROSD_SCHEMATIC_ENTRY_BASELINE_v1.2_FA.txt; Design_Status: DESIGN_LOCK_MICROSD_V1.2_PIN_NUMBER_CONVENTION_PENDING_FOOTPRINT_CROSSCHECK; Qualification_Status: UNQUALIFIED_PENDING_SAVE_REOPEN_AUDIT; PIN_NUMBER_SOURCE: INTERNAL_CONVENTION_PENDING_PHYSICAL_ORIENTATION_CROSSCHECK; PIN_FUNCTION_SOURCE: MANUFACTURER_DATASHEET; MPN: AO3401A; Value: AO3401A; Package: SOT-23; Datasheet: https://www.aosmd.com/sites/default/files/res/datasheets/AO3401A.pdf
Q_SD_DRV = BC847B: 45V 100mA NPN general-purpose transistor used as SD gate driver; Manufacturer: Nexperia; Source_Baseline: MICROSD_SCHEMATIC_ENTRY_BASELINE_v1.2_FA.txt; Design_Status: DESIGN_LOCK_MICROSD_V1.2; Qualification_Status: UNQUALIFIED_PENDING_SAVE_REOPEN_AUDIT; PIN_NUMBER_SOURCE: MANUFACTURER_DATASHEET; MPN: BC847B; Value: BC847B; Package: SOT-23 / TO-236AB; Datasheet: https://assets.nexperia.com/documents/data-sheet/BC847X_SER.pdf; PIN_FUNCTION_SOURCE: MANUFACTURER_DATASHEET
R_BASE_PD R_CD_PU R_CS_PU R_GATE R_MISO_PD = 0603WAF1003T5E: as R_BE_PU on sheet 01_POWER; MPN: 0603WAF1003T5E; Value: 100k 1%; Package: 0603; Datasheet: UNI-ROYAL manufacturer resistor data
R_MISO = SER0603F22R: MicroSD MISO series resistor; Manufacturer: VO Sub Brand (ER) [supplier-listed]; Source_Baseline: MICROSD_SCHEMATIC_ENTRY_BASELINE_v1.2_FA.txt; Design_Status: DESIGN_LOCK_MICROSD_V1.2_FOOTPRINT_SOURCE_HOLD; Qualification_Status: UNQUALIFIED_PENDING_SAVE_REOPEN_AUDIT; PIN_NUMBER_SOURCE: INTERNAL_CONVENTION_1_2; PIN_FUNCTION_SOURCE: CONTROLLED_BOM_PLUS_SUPPLIER_LISTING; MPN: SER0603F22R; Value: 22ohm 1%; Package: 0603; Datasheet: https://lionelectronic.ir/products/1154-SER0603F22R
R_SD_DRV_BASE = CR0603FA1002G: MicroSD SD gate-driver base resistor; Manufacturer: LIZ [supplier-listed]; Source_Baseline: MICROSD_SCHEMATIC_ENTRY_BASELINE_v1.2_FA.txt; Design_Status: DESIGN_LOCK_MICROSD_V1.2_FOOTPRINT_SOURCE_HOLD; Qualification_Status: UNQUALIFIED_PENDING_SAVE_REOPEN_AUDIT; PIN_NUMBER_SOURCE: INTERNAL_CONVENTION_1_2; PIN_FUNCTION_SOURCE: CONTROLLED_BOM_PLUS_EXACT_PART_LISTING; MPN: CR0603FA1002G; Value: 10kohm 1% 100mW; Package: 0603; Datasheet: MicroSD v1.3 plus exact-part supplier listing
U_SD_BUF = 74HC125D,653: Quad buffer/line driver with 3-state outputs; OE active-low; Manufacturer: Nexperia; Source_Baseline: MICROSD_SCHEMATIC_ENTRY_BASELINE_v1.2_FA.txt; Design_Status: DESIGN_LOCK_MICROSD_V1.2; Qualification_Status: UNQUALIFIED_PENDING_SAVE_REOPEN_AUDIT; PIN_NUMBER_SOURCE: MANUFACTURER_DATASHEET; MPN: 74HC125D,653; Value: 74HC125D,653; Package: SO14 / SOT108-1; Datasheet: https://assets.nexperia.com/documents/data-sheet/74HC_HCT125.pdf; PIN_FUNCTION_SOURCE: MANUFACTURER_DATASHEET

## Sheet 04_NAVIGATION.SchDoc
size A4; SheetNumber: 4; SheetTotal: 7
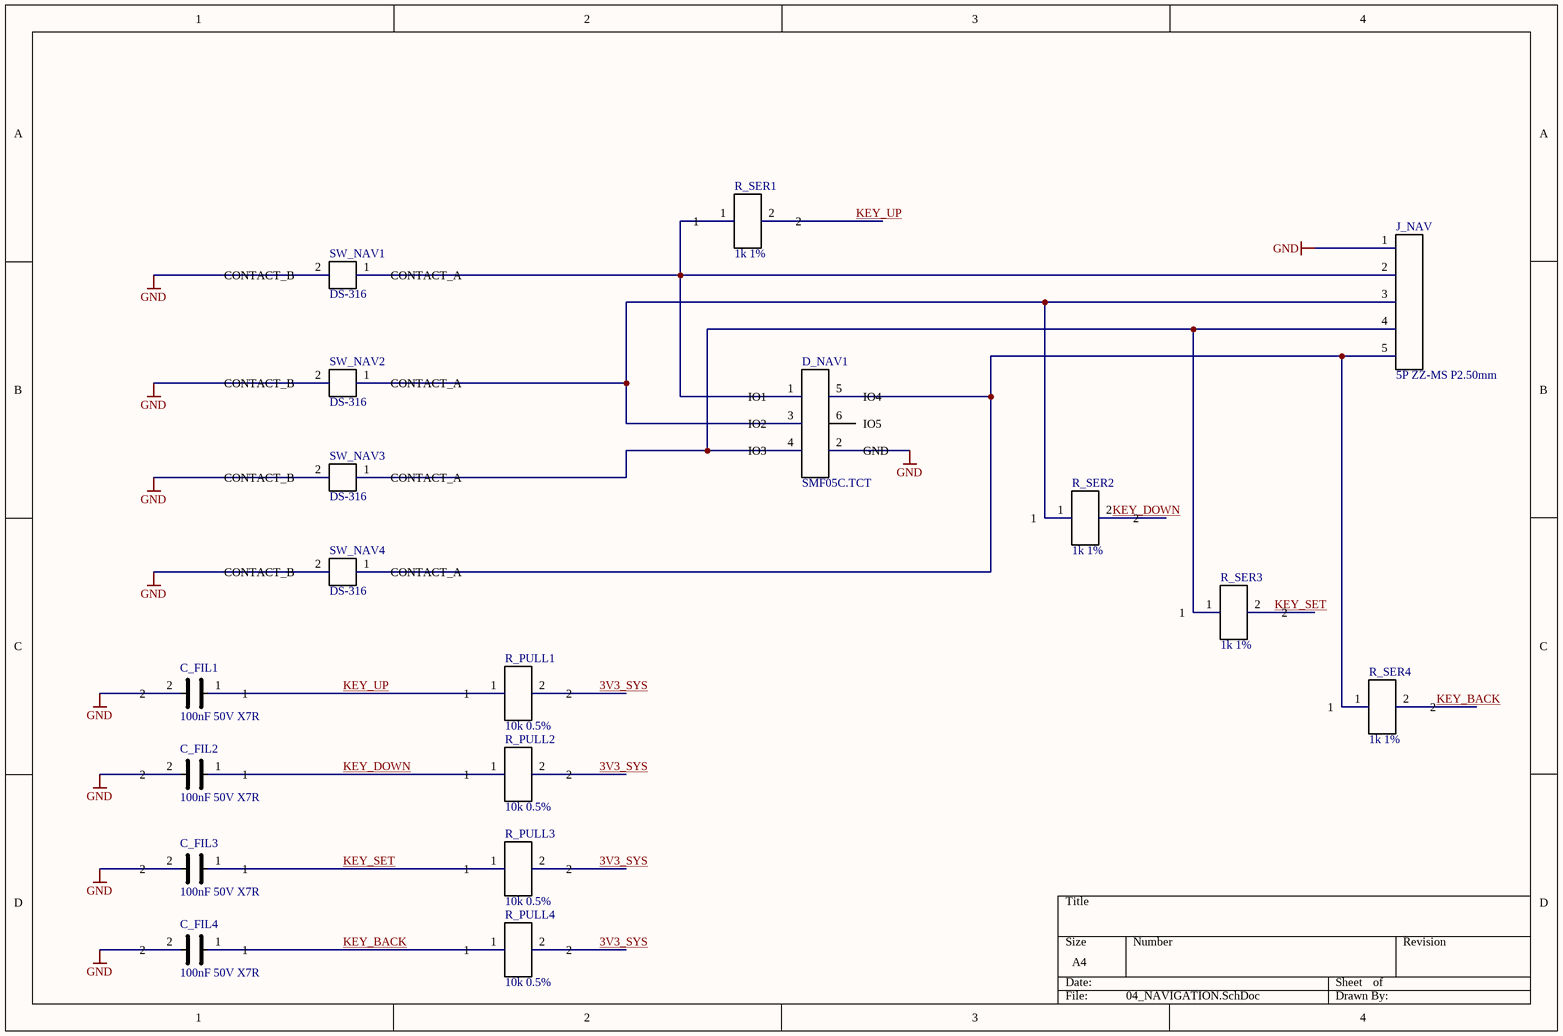
[diagram p3: 04_NAVIGATION.SchDoc]

### Parts
C_FIL1  100nF 50V X7R  [SAMSUNG_CL10_0603_CAP_2P]
C_FIL2  100nF 50V X7R  [SAMSUNG_CL10_0603_CAP_2P]
C_FIL3  100nF 50V X7R  [SAMSUNG_CL10_0603_CAP_2P]
C_FIL4  100nF 50V X7R  [SAMSUNG_CL10_0603_CAP_2P]
D_NAV1  SMF05C.TCT  [SEMTECH_SC70_6L_SMF05C]
J_NAV  5P ZZ-MS P2.50mm  [SHOUHAN_2P50_1X05_ZZMS_THT]
R_PULL1  10k 0.5%  [RES_0805_SHARED_2P]
R_PULL2  10k 0.5%  [RES_0805_SHARED_2P]
R_PULL3  10k 0.5%  [RES_0805_SHARED_2P]
R_PULL4  10k 0.5%  [RES_0805_SHARED_2P]
R_SER1  1k 1%  [RES_0805_SHARED_2P]
R_SER2  1k 1%  [RES_0805_SHARED_2P]
R_SER3  1k 1%  [RES_0805_SHARED_2P]
R_SER4  1k 1%  [RES_0805_SHARED_2P]
SW_NAV1  DS-316
SW_NAV2  DS-316
SW_NAV3  DS-316
SW_NAV4  DS-316

### Nets
GND: C_FIL1.2 C_FIL2.2 C_FIL3.2 C_FIL4.2 D_NAV1.2(GND) J_NAV.1 SW_NAV1.2(CONTACT_B) SW_NAV2.2(CONTACT_B) SW_NAV3.2(CONTACT_B) SW_NAV4.2(CONTACT_B)
3V3_SYS: R_PULL1.2 R_PULL2.2 R_PULL3.2 R_PULL4.2
KEY_BACK: C_FIL4.1 R_PULL4.1 R_SER4.2
KEY_DOWN: C_FIL2.1 R_PULL2.1 R_SER2.2
KEY_SET: C_FIL3.1 R_PULL3.1 R_SER3.2
KEY_UP: C_FIL1.1 R_PULL1.1 R_SER1.2
NetD_NAV1_1: D_NAV1.1(IO1) J_NAV.2 R_SER1.1 SW_NAV1.1(CONTACT_A)
NetD_NAV1_3: D_NAV1.3(IO2) J_NAV.3 R_SER2.1 SW_NAV2.1(CONTACT_A)
NetD_NAV1_4: D_NAV1.4(IO3) J_NAV.4 R_SER3.1 SW_NAV3.1(CONTACT_A)
NetD_NAV1_5: D_NAV1.5(IO4) J_NAV.5 R_SER4.1 SW_NAV4.1(CONTACT_A)

Not connected (* = marked no-connect by the designer): D_NAV1 6(IO5)

### Library data of the parts
C_FIL1-C_FIL4 = CL10B104KB8NNNC: as C_MCU_HF on sheet 02_MCU_CORE; MPN: CL10B104KB8NNNC; Value: 100nF 50V X7R; Package: 0603 / 1608 metric; Datasheet: https://product.samsungsem.com/mlcc/CL10B104KB8NNN.do
D_NAV1 = SMF05C.TCT: as D1 on sheet 01_POWER; MPN: SMF05C.TCT; Value: SMF05C.TCT; Package: SC70-6; Datasheet: https://www.semtech.com/products/circuit-protection/esd-protection/smf05c; PIN_FUNCTION_SOURCE: MANUFACTURER_DATASHEET
J_NAV = 2.54mm-5P ZZ-MS: Five-position vertical THT Navigation connector; SHOUHAN drawing pitch 2.50 mm; Manufacturer: SHENZHEN SHOUHAN TECHNOLOGY CO., LTD; Source_Baseline: TASK17_NAVIGATION_ENTRY_BASELINE_v1.0_FA.txt; Design_Status: DESIGN_LOCK_NAV_V1.0_JNAV; Qualification_Status: UNQUALIFIED_PENDING_SAVE_REOPEN_AUDIT; PIN_NUMBER_SOURCE: PROJECT_INTERNAL_CONVENTION_LEFT_TO_RIGHT; PIN_FUNCTION_SOURCE: NAVIGATION_V1.0_PROJECT_CONNECTOR_MAPPING; MPN: 2.54mm-5P ZZ-MS; Value: 2.54mm-5P ZZ-MS; Package: 1x5 vertical THT; drawing pitch 2.50mm; Datasheet: SHOUHAN exact 2.54mm-5P ZZ-MS specification/drawing
R_PULL1-R_PULL4 = ARG05DTC1002: as R_BOTTOM_A on sheet 01_POWER; MPN: ARG05DTC1002; Value: 10k 0.5%; Package: 0805 / ARG05; Datasheet: Viking Tech AR series product data
R_SER1-R_SER4 = 0805W8F1001T5E: as R_K1 on sheet 01_POWER; MPN: 0805W8F1001T5E; Value: 1k 1%; Package: 0805; Datasheet: UNI-ROYAL manufacturer resistor data
SW_NAV1-SW_NAV4 = DS-316: Panel SPST-NO momentary push button; off-board Navigation switch; Manufacturer: DAIER / controlled DS-316 family; Source_Baseline: TASK17_NAVIGATION_ENTRY_BASELINE_v1.0_FA.txt; Design_Status: DESIGN_LOCK_NAV_V1.0_OFFBOARD; Qualification_Status: UNQUALIFIED_PENDING_SAVE_REOPEN_AUDIT; PIN_NUMBER_SOURCE: PROJECT_INTERNAL_CONVENTION; PIN_FUNCTION_SOURCE: NAVIGATION_V1.0_SPST_NO; MPN: DS-316; Value: DS-316; Package: Panel mount; no PCB footprint; Datasheet: Controlled Navigation v1.0 / DS-316 family source

## Sheet 05_RTC.SchDoc
size A4; SheetNumber: 5; SheetTotal: 7
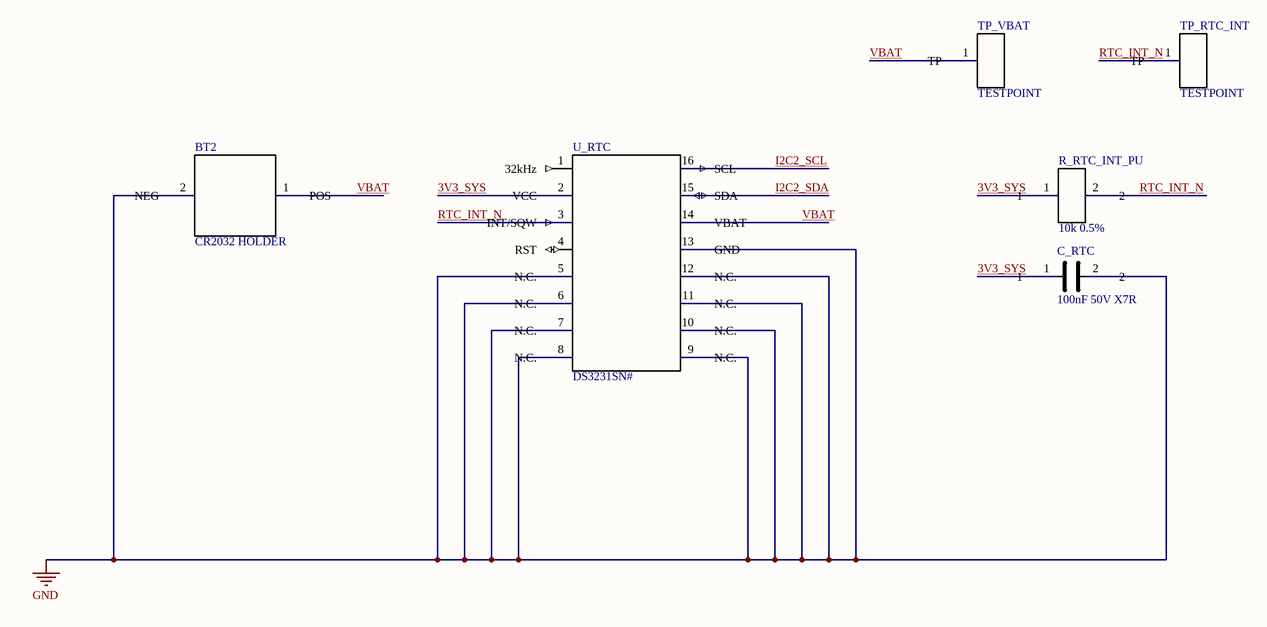
[diagram p4: 05_RTC.SchDoc]

### Parts
BT2  CR2032 HOLDER  [CR2032_HOLDER_VERTICAL_P20_D0P90_2P_THT_REV_B]
C_RTC  100nF 50V X7R  [SAMSUNG_CL10_0603_CAP_2P]
R_RTC_INT_PU  10k 0.5%  [RES_0805_SHARED_2P]
TP_RTC_INT  TESTPOINT  [TESTPOINT_GENERIC_1P5MM]
TP_VBAT  TESTPOINT  [TESTPOINT_GENERIC_1P5MM]
U_RTC  DS3231SN#  [MAXIM_W16H2_SO16_90_0107]

### Nets
GND: BT2.2(NEG) C_RTC.2 U_RTC.5(N.C.) U_RTC.6(N.C.) U_RTC.7(N.C.) U_RTC.8(N.C.) U_RTC.9(N.C.) U_RTC.10(N.C.) U_RTC.11(N.C.) U_RTC.12(N.C.) U_RTC.13(GND)
3V3_SYS: C_RTC.1 R_RTC_INT_PU.1 U_RTC.2(VCC)
I2C2_SCL: U_RTC.16(SCL)
I2C2_SDA: U_RTC.15(SDA)
RTC_INT_N: R_RTC_INT_PU.2 TP_RTC_INT.1(TP) U_RTC.3(INT/SQW)
VBAT: BT2.1(POS) TP_VBAT.1(TP) U_RTC.14(VBAT)

Not connected (* = marked no-connect by the designer): U_RTC 1(32kHz) 4(RST)

### Library data of the parts
BT2 = CR2032_HOLDER_USER_DRAWING: Datalogger Rev-A CR2032 vertical THT holder, user-confirmed drawing, 20.00 mm pitch; Manufacturer: UNKNOWN - USER DRAWING; Source_Baseline: Datalogger_RTC_CR2032_Final_BOM_RevA_v1.2_FA.pdf; Physical_Drawing: USER_CONFIRMED_CR2032_HOLDER_DRAWING_2026-08-22; PIN_NUMBER_SOURCE: INTERNAL_CONVENTION; PIN_FUNCTION_SOURCE: USER_CONFIRMED_PHYSICAL_DRAWING; Pin1_Function: POS_VBAT; Pin1_Physical: RIGHT_HOLE_X_PLUS_10P00_MM_TOP_VIEW; Pin2_Function: NEG_GND; Pin2_Physical: LEFT_HOLE_X_MINUS_10P00_MM_TOP_VIEW; Qualification_Status: UNQUALIFIED_PENDING_SAVE_REOPEN_AUDIT; MPN: UNKNOWN - USER DRAWING; Package: Vertical THT, 2-pin, 20.00 mm pitch; Footprint_Target: CR2032_HOLDER_P20_2P_THT
C_RTC = CL10B104KB8NNNC: as C_MCU_HF on sheet 02_MCU_CORE; MPN: CL10B104KB8NNNC; Value: 100nF 50V X7R; Package: 0603 / 1608 metric; Datasheet: https://product.samsungsem.com/mlcc/CL10B104KB8NNN.do
R_RTC_INT_PU = ARG05DTC1002: as R_BOTTOM_A on sheet 01_POWER; MPN: ARG05DTC1002; Value: 10k 0.5%; Package: 0805 / ARG05; Datasheet: Viking Tech AR series product data
TP_RTC_INT TP_VBAT = TESTPOINT_GENERIC: as TP_3V3_SYS on sheet 01_POWER; MPN: TESTPOINT_GENERIC; Value: TESTPOINT; Package: LOGICAL; Datasheet: POWER_SCHEMATIC_ENTRY_BASELINE_v0.17_FA.txt; Design_Status: PROJECT_LOGICAL; PIN_FUNCTION_SOURCE: PROJECT_LOGICAL_DEFINITION
U_RTC = DS3231SN#: Analog Devices/Maxim DS3231 industrial I2C RTC/TCXO, 16-SO W16#H2; Manufacturer: Analog Devices / Maxim Integrated; Package_Outline: 21-0042; Land_Pattern: 90-0107; Source_Baseline: Datalogger_RTC_CR2032_Final_BOM_RevA_v1.2_FA.pdf; PIN_NUMBER_SOURCE: MANUFACTURER_DATASHEET; Qualification_Status: UNQUALIFIED_PENDING_SAVE_REOPEN_AUDIT; MPN: DS3231SN#; Package: 16 SO, 300 mil, W16#H2; Datasheet: Analog Devices DS3231 Rev.10; PIN_FUNCTION_SOURCE: MANUFACTURER_DATASHEET

## Sheet 06_OLED_SHT3X.SchDoc
size A3; SheetNumber: 6; SheetTotal: 7
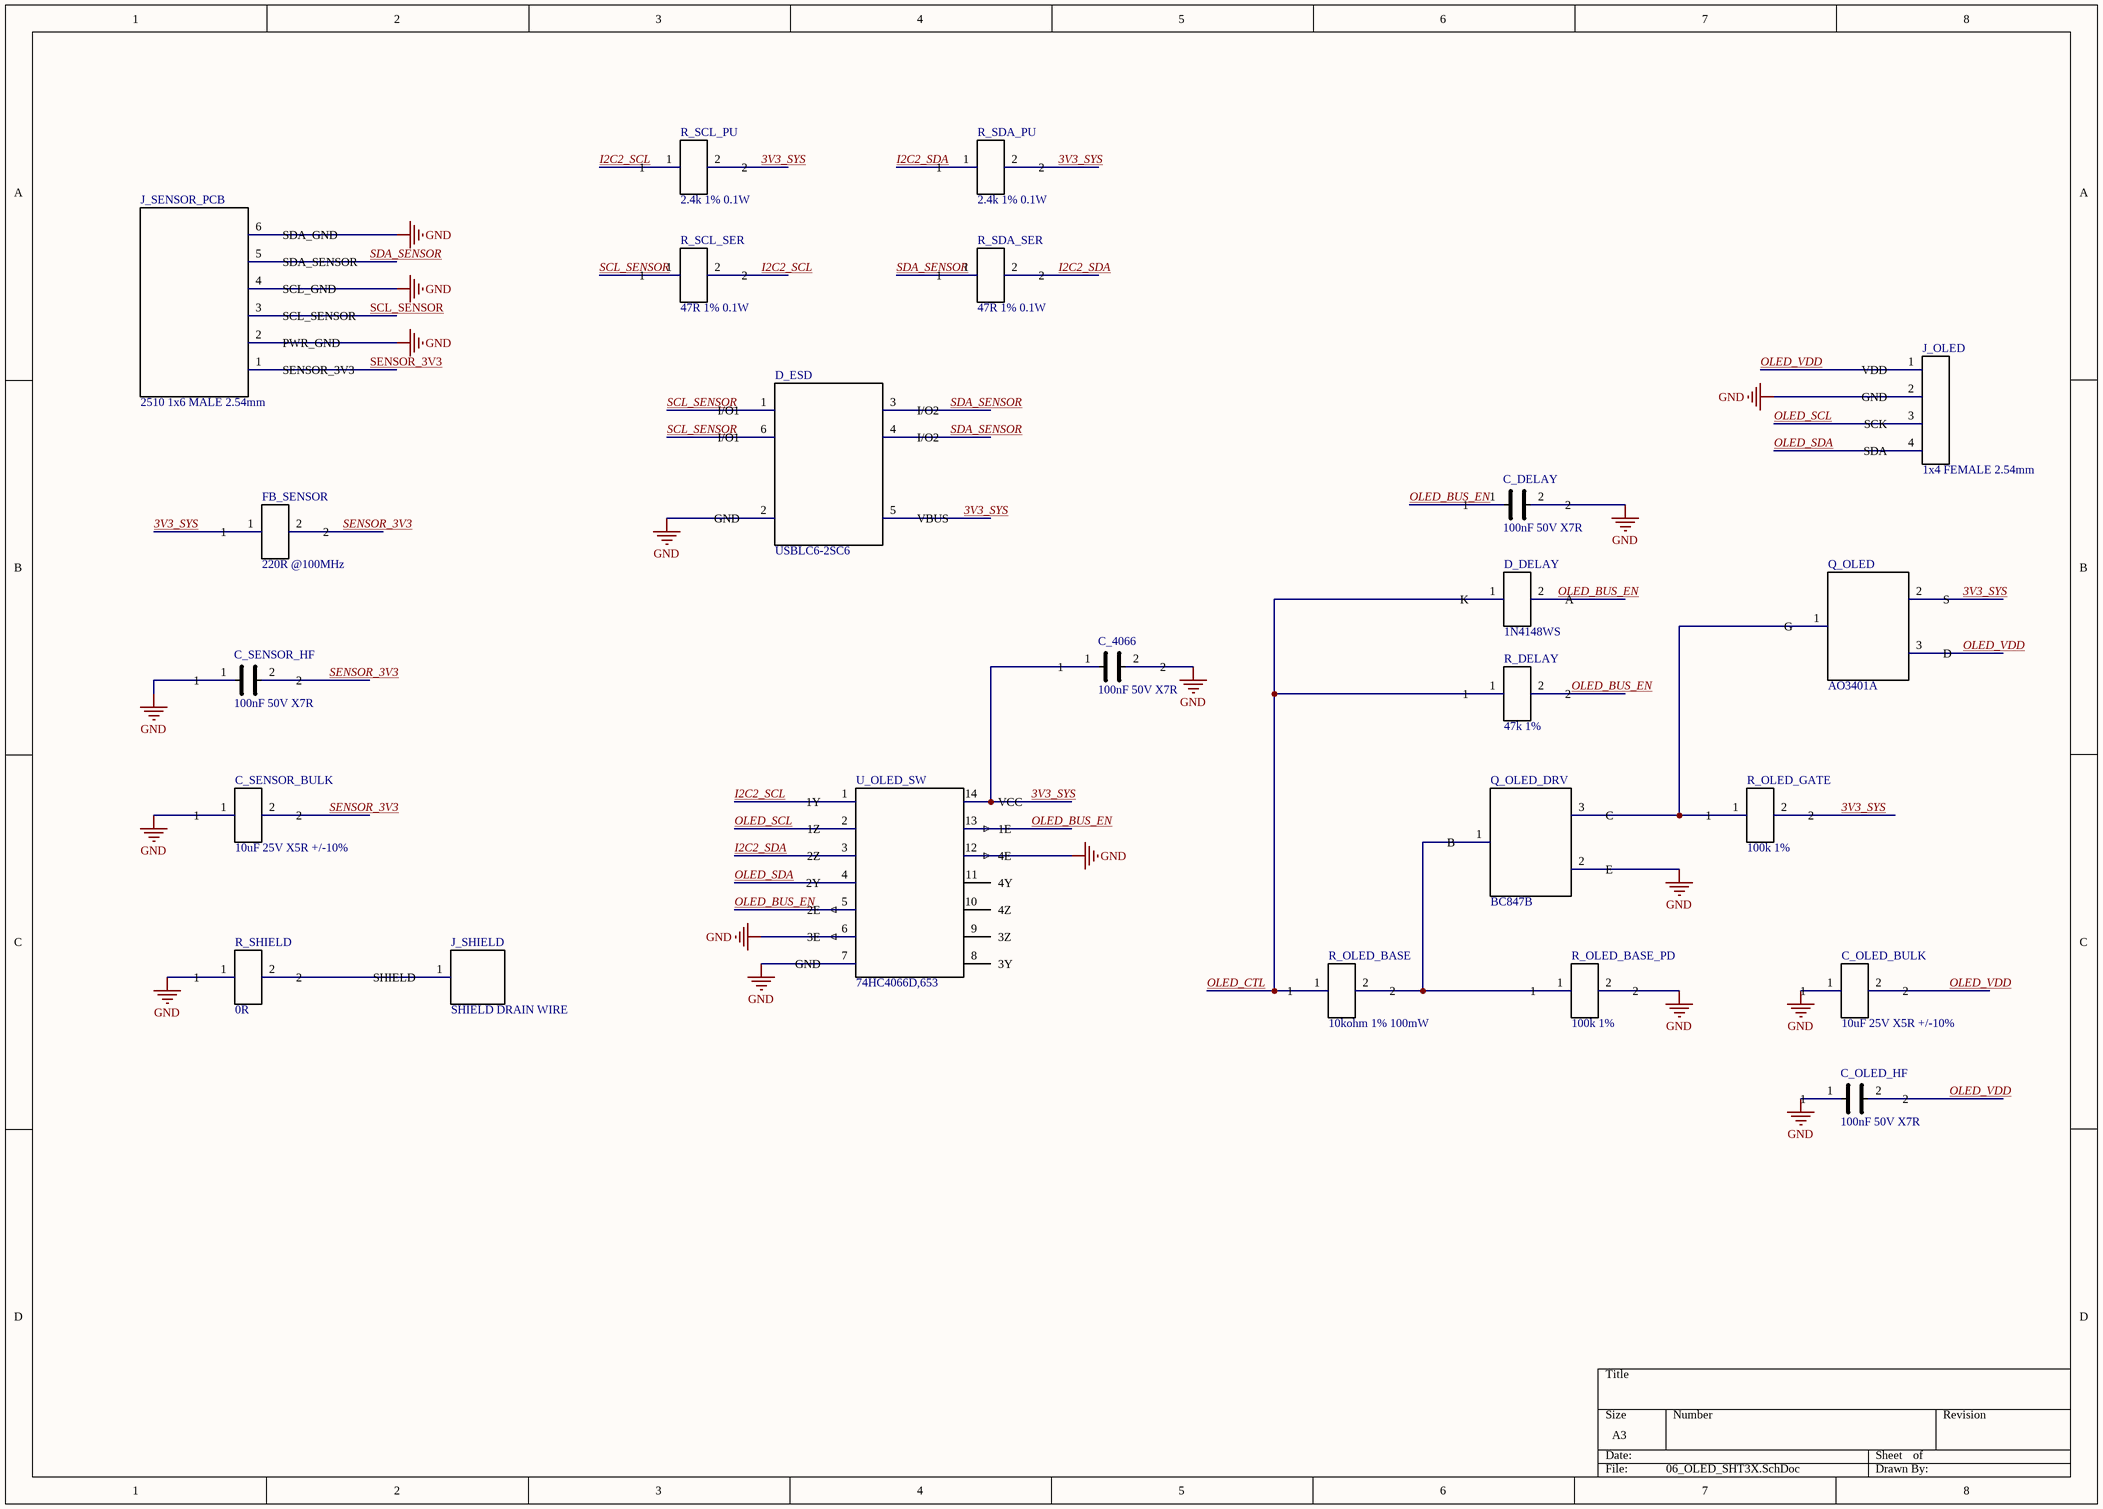
[diagram p5: 06_OLED_SHT3X.SchDoc]

### Parts
C_4066  100nF 50V X7R  [SAMSUNG_CL10_0603_CAP_2P]
C_DELAY  100nF 50V X7R  [SAMSUNG_CL10_0603_CAP_2P]
C_OLED_BULK  10uF 25V X5R +/-10%  [MURATA_GRM21_0805_CAP_2P]
C_OLED_HF  100nF 50V X7R  [SAMSUNG_CL10_0603_CAP_2P]
C_SENSOR_BULK  10uF 25V X5R +/-10%  [MURATA_GRM21_0805_CAP_2P]
C_SENSOR_HF  100nF 50V X7R  [SAMSUNG_CL10_0603_CAP_2P]
D_DELAY  1N4148WS  [DIODES_SOD323_1N4148WS_2P]
D_ESD  USBLC6-2SC6  [ST_SOT23_6L_USBLC6_6P]
FB_SENSOR  220R @100MHz  [RES_0805_SHARED_2P]
J_OLED  1x4 FEMALE 2.54mm  [GENERIC_SOCKET_1X4_P2P54_THT]
J_SENSOR_PCB  2510 1x6 MALE 2.54mm  [GENERIC_2510_1X6_P2P54_THT]
J_SHIELD  SHIELD DRAIN WIRE  [WIRE_DRAIN_1P_D1P20_P2P40_THT]
Q_OLED  AO3401A  [AOS_SOT23_AO3401A_3P]
Q_OLED_DRV  BC847B  [NEXPERIA_SOT23_TO236AB_3P]
R_DELAY  47k 1%  [RES_0603_SHARED_2P]
R_OLED_BASE  10kohm 1% 100mW  [RES_0603_SHARED_2P]
R_OLED_BASE_PD  100k 1%  [RES_0603_SHARED_2P]
R_OLED_GATE  100k 1%  [RES_0603_SHARED_2P]
R_SCL_PU  2.4k 1% 0.1W  [RES_0603_SHARED_2P]
R_SCL_SER  47R 1% 0.1W  [RES_0603_SHARED_2P]
R_SDA_PU  2.4k 1% 0.1W  [RES_0603_SHARED_2P]
R_SDA_SER  47R 1% 0.1W  [RES_0603_SHARED_2P]
R_SHIELD  0R  [RES_0603_SHARED_2P]
U_OLED_SW  74HC4066D,653  [NEXPERIA_SOT108_1_SO14_14P]

### Nets
GND: C_4066.2 C_DELAY.2 C_OLED_BULK.1 C_OLED_HF.1 C_SENSOR_BULK.1 C_SENSOR_HF.1 D_ESD.2(GND) J_OLED.2(GND) J_SENSOR_PCB.2(PWR_GND) J_SENSOR_PCB.4(SCL_GND) J_SENSOR_PCB.6(SDA_GND) Q_OLED_DRV.2(E) R_OLED_BASE_PD.2 R_SHIELD.1 U_OLED_SW.6(3E) U_OLED_SW.7(GND) U_OLED_SW.12(4E)
3V3_SYS: C_4066.1 D_ESD.5(VBUS) FB_SENSOR.1 Q_OLED.2(S) R_OLED_GATE.2 R_SCL_PU.2 R_SDA_PU.2 U_OLED_SW.14(VCC)
I2C2_SCL: R_SCL_PU.1 R_SCL_SER.2 U_OLED_SW.1(1Y)
I2C2_SDA: R_SDA_PU.1 R_SDA_SER.2 U_OLED_SW.3(2Z)
OLED_BUS_EN: C_DELAY.1 D_DELAY.2(A) R_DELAY.2 U_OLED_SW.5(2E) U_OLED_SW.13(1E)
OLED_CTL: D_DELAY.1(K) R_DELAY.1 R_OLED_BASE.1
OLED_SCL: J_OLED.3(SCK) U_OLED_SW.2(1Z)
OLED_SDA: J_OLED.4(SDA) U_OLED_SW.4(2Y)
OLED_VDD: C_OLED_BULK.2 C_OLED_HF.2 J_OLED.1(VDD) Q_OLED.3(D)
SCL_SENSOR: D_ESD.1(I/O1) D_ESD.6(I/O1) J_SENSOR_PCB.3(SCL_SENSOR) R_SCL_SER.1
SDA_SENSOR: D_ESD.3(I/O2) D_ESD.4(I/O2) J_SENSOR_PCB.5(SDA_SENSOR) R_SDA_SER.1
SENSOR_3V3: C_SENSOR_BULK.2 C_SENSOR_HF.2 FB_SENSOR.2 J_SENSOR_PCB.1(SENSOR_3V3)
NetJ_SHIELD_1: J_SHIELD.1(SHIELD) R_SHIELD.2
NetQ_OLED_1: Q_OLED.1(G) Q_OLED_DRV.3(C) R_OLED_GATE.1
NetQ_OLED_DRV_1: Q_OLED_DRV.1(B) R_OLED_BASE.2 R_OLED_BASE_PD.1

Not connected (* = marked no-connect by the designer): U_OLED_SW 8(3Y) 9(3Z) 10(4Z) 11(4Y)

### Library data of the parts
C_4066 C_DELAY C_OLED_HF C_SENSOR_HF = CL10B104KB8NNNC: as C_MCU_HF on sheet 02_MCU_CORE; MPN: CL10B104KB8NNNC; Value: 100nF 50V X7R; Package: 0603 / 1608 metric; Datasheet: https://product.samsungsem.com/mlcc/CL10B104KB8NNN.do
C_OLED_BULK C_SENSOR_BULK = GRM21BR61E106KA73L: as C_SD_MID on sheet 03_MICROSD; MPN: GRM21BR61E106KA73L; Value: 10uF 25V X5R +/-10%; Package: 2012M / EIA 0805; Datasheet: https://pim.murata.com/en-global/pim/details/?partNum=GRM21BR61E106KA73%23
D_DELAY = 1N4148WS: Fast switching diode; SOD323; pin 1 cathode K, pin 2 anode A for Task19 delay discharge path; Manufacturer: MULTISOURCE; FOOTPRINT GEOMETRY SOURCE=Diodes Incorporated; Source_Baseline: Datalogger_OLED_SHT3x_Final_BOM_RevA_v1.3_FA.pdf + TASK18_RTC_RELEASE_2026-08-22 + TASK19_CONTROLLED_DELTAS_2026-08-22; Design_Status: TASK19_BOM_DEVICE_GEOMETRY_DIODES_INC_REFERENCE; Qualification_Status: UNQUALIFIED_PENDING_SAVE_REOPEN_AUDIT; PIN_NUMBER_SOURCE: MANUFACTURER_DATASHEET; MPN: 1N4148WS; Value: 1N4148WS; Package: SOD323; Datasheet: https://www.diodes.com/datasheet/download/1N4148WS.pdf; PIN_FUNCTION_SOURCE: MANUFACTURER_DATASHEET
D_ESD = USBLC6-2SC6: as D_ESD1 on sheet 03_MICROSD; MPN: USBLC6-2SC6; Value: USBLC6-2SC6; Package: SOT23-6L; Datasheet: https://www.st.com/resource/en/datasheet/usblc6-2.pdf; PIN_FUNCTION_SOURCE: MANUFACTURER_DATASHEET
FB_SENSOR = BLM21PG221SN1D: Murata BLM21PG ferrite bead, 0805/2012, Task19 sensor supply filter; Manufacturer: Murata Manufacturing Co., Ltd.; Source_Baseline: Datalogger_OLED_SHT3x_Final_BOM_RevA_v1.3_FA.pdf + TASK18_RTC_RELEASE_2026-08-22 + TASK19_CONTROLLED_DELTAS_2026-08-22; Design_Status: TASK19_CONTROLLED_BOM_REUSE_RES_0805_SHARED_2P; Qualification_Status: UNQUALIFIED_PENDING_SAVE_REOPEN_AUDIT; PIN_NUMBER_SOURCE: INTERNAL_CONVENTION; PIN_FUNCTION_SOURCE: SYMMETRIC_PASSIVE_DEVICE; MPN: BLM21PG221SN1D; Value: 220R @100MHz; Package: 0805 / 2012 metric; Datasheet: Murata official BLM21PG221SN1D product data
J_OLED = PBS-2.54-1X4GF: Generic 1x4 straight female THT socket for OLED module; purchase identity PBS-2.54-1X4GF; module side is male; Source_Baseline: Datalogger_OLED_SHT3x_Final_BOM_RevA_v1.3_FA.pdf + TASK18_RTC_RELEASE_2026-08-22 + TASK19_CONTROLLED_DELTAS_2026-08-22; Design_Status: TASK19_GENERIC_HEADER_USER_APPROVED_2026-08-22; Qualification_Status: UNQUALIFIED_PENDING_SAVE_REOPEN_AUDIT; PIN_NUMBER_SOURCE: PROJECT_INTERNAL_LEFT_TO_RIGHT_1_TO_4; PIN_FUNCTION_SOURCE: OLED_MODULE_PRINT_AND_CONTROLLED_BOM; Manufacturer: GENERIC; MPN: PBS-2.54-1X4GF; Value: 1x4 FEMALE 2.54mm; Package: THT 1x4, pitch 2.54 mm; Datasheet: Generic geometry reference: Wurth Elektronik 61300411821; project user approval 2026-08-22
J_SENSOR_PCB = 2510-1X6-MALE-THT: PCB-mounted internal SHT3x harness connector; 6-pin straight male 2.54 mm 2510-style THT; external metal/military panel connector remains separate; Manufacturer: GENERIC; Source_Baseline: T20_USER_APPROVAL_2026-08-26; Design_Status: TASK20_CONTROLLED_PCB_CONNECTOR; Qualification_Status: MECHANICAL_FIT_PENDING_PHYSICAL_SAMPLE; PIN_NUMBER_SOURCE: PROJECT_INTERNAL_PCB_ORDER_LOCK_2026-08-26; PIN_FUNCTION_SOURCE: USER_APPROVED_T20_SIGNAL_ORDER_2026-08-26; MPN: 2510-1X6-MALE-THT; Value: 2510 1x6 MALE 2.54mm; Package: THT 1x6, pitch 2.54 mm; Datasheet: USER_SUPPLIED_6CCT_2P54_DRAWING_2026-08-26; supplier code 2171001040
J_SHIELD = WIRE_DRAIN_1P_THT: Dedicated PCB termination for external cable shield/drain wire; 1-pin THT solder pad; Task20 controlled; Manufacturer: GENERIC; Design_Status: TASK20_CONTROLLED; Qualification_Status: PHYSICAL_FIT_PENDING; Cable_Target: 3-pair x 24AWG shielded, drain wire; MPN: WIRE_DRAIN_1P_THT; Value: SHIELD DRAIN WIRE; Package: 1-pin THT solder pad
Q_OLED = AO3401A: as Q_SD on sheet 03_MICROSD; MPN: AO3401A; Value: AO3401A; Package: SOT-23; Datasheet: https://www.aosmd.com/sites/default/files/res/datasheets/AO3401A.pdf
Q_OLED_DRV = BC847B: as Q_SD_DRV on sheet 03_MICROSD; MPN: BC847B; Value: BC847B; Package: SOT-23 / TO-236AB; Datasheet: https://assets.nexperia.com/documents/data-sheet/BC847X_SER.pdf; PIN_FUNCTION_SOURCE: MANUFACTURER_DATASHEET
R_DELAY = 0603WAF4702T5E: as R_BOTTOM_B on sheet 01_POWER; MPN: 0603WAF4702T5E; Value: 47k 1%; Package: 0603; Datasheet: UNI-ROYAL manufacturer resistor data
R_OLED_BASE = CR0603FA1002G: as R_SD_DRV_BASE on sheet 03_MICROSD; MPN: CR0603FA1002G; Value: 10kohm 1% 100mW; Package: 0603; Datasheet: MicroSD v1.3 plus exact-part supplier listing
R_OLED_BASE_PD R_OLED_GATE = 0603WAF1003T5E: as R_BE_PU on sheet 01_POWER; MPN: 0603WAF1003T5E; Value: 100k 1%; Package: 0603; Datasheet: UNI-ROYAL manufacturer resistor data
R_SCL_PU R_SDA_PU = 0603WAF2401T5E: Task19 external SHT3x I2C pull-up resistor; Manufacturer: UNI-ROYAL; Source_Baseline: Datalogger_OLED_SHT3x_Final_BOM_RevA_v1.3_FA.pdf + TASK18_RTC_RELEASE_2026-08-22 + TASK19_CONTROLLED_DELTAS_2026-08-22; Design_Status: TASK19_CONTROLLED_BOM_REUSE_RES_0603_SHARED_2P; Qualification_Status: UNQUALIFIED_PENDING_SAVE_REOPEN_AUDIT; PIN_NUMBER_SOURCE: INTERNAL_CONVENTION; PIN_FUNCTION_SOURCE: SYMMETRIC_PASSIVE_DEVICE; MPN: 0603WAF2401T5E; Value: 2.4k 1% 0.1W; Package: 0603 / 1608 metric; Datasheet: Controlled BOM value/package; existing UNI-ROYAL WAF family in released project library
R_SCL_SER R_SDA_SER = 0603WAF470JT5E: Task19 SHT3x I2C series resistor; Manufacturer: UNI-ROYAL; Source_Baseline: Datalogger_OLED_SHT3x_Final_BOM_RevA_v1.3_FA.pdf + TASK18_RTC_RELEASE_2026-08-22 + TASK19_CONTROLLED_DELTAS_2026-08-22; Design_Status: TASK19_CONTROLLED_BOM_REUSE_RES_0603_SHARED_2P; Qualification_Status: UNQUALIFIED_PENDING_SAVE_REOPEN_AUDIT; PIN_NUMBER_SOURCE: INTERNAL_CONVENTION; PIN_FUNCTION_SOURCE: SYMMETRIC_PASSIVE_DEVICE; MPN: 0603WAF470JT5E; Value: 47R 1% 0.1W; Package: 0603 / 1608 metric; Datasheet: Controlled BOM value/package; existing UNI-ROYAL WAF family in released project library
R_SHIELD = SER0603J0R: as R_MODE on sheet 01_POWER; MPN: SER0603J0R; Value: 0R; Package: 0603; Datasheet: SER0603J0R-VO-Sub-Brand-(ER).pdf
U_OLED_SW = 74HC4066D,653: Nexperia quad SPST analog switch; enable inputs active HIGH; SO14 SOT108-1; Source_Baseline: Datalogger_OLED_SHT3x_Final_BOM_RevA_v1.3_FA.pdf + TASK18_RTC_RELEASE_2026-08-22 + TASK19_CONTROLLED_DELTAS_2026-08-22; Design_Status: TASK19_CONTROLLED_NEXPERIA_REV12; Qualification_Status: UNQUALIFIED_PENDING_SAVE_REOPEN_AUDIT; PIN_NUMBER_SOURCE: MANUFACTURER_DATASHEET; Manufacturer: Nexperia; MPN: 74HC4066D,653; Value: 74HC4066D,653; Package: SO14 / SOT108-1; Datasheet: https://assets.nexperia.com/documents/data-sheet/74HC_HCT4066.pdf; PIN_FUNCTION_SOURCE: MANUFACTURER_DATASHEET

## Sheet 07_EXPANSION.SchDoc
size A4; SheetNumber: 7; SheetTotal: 7
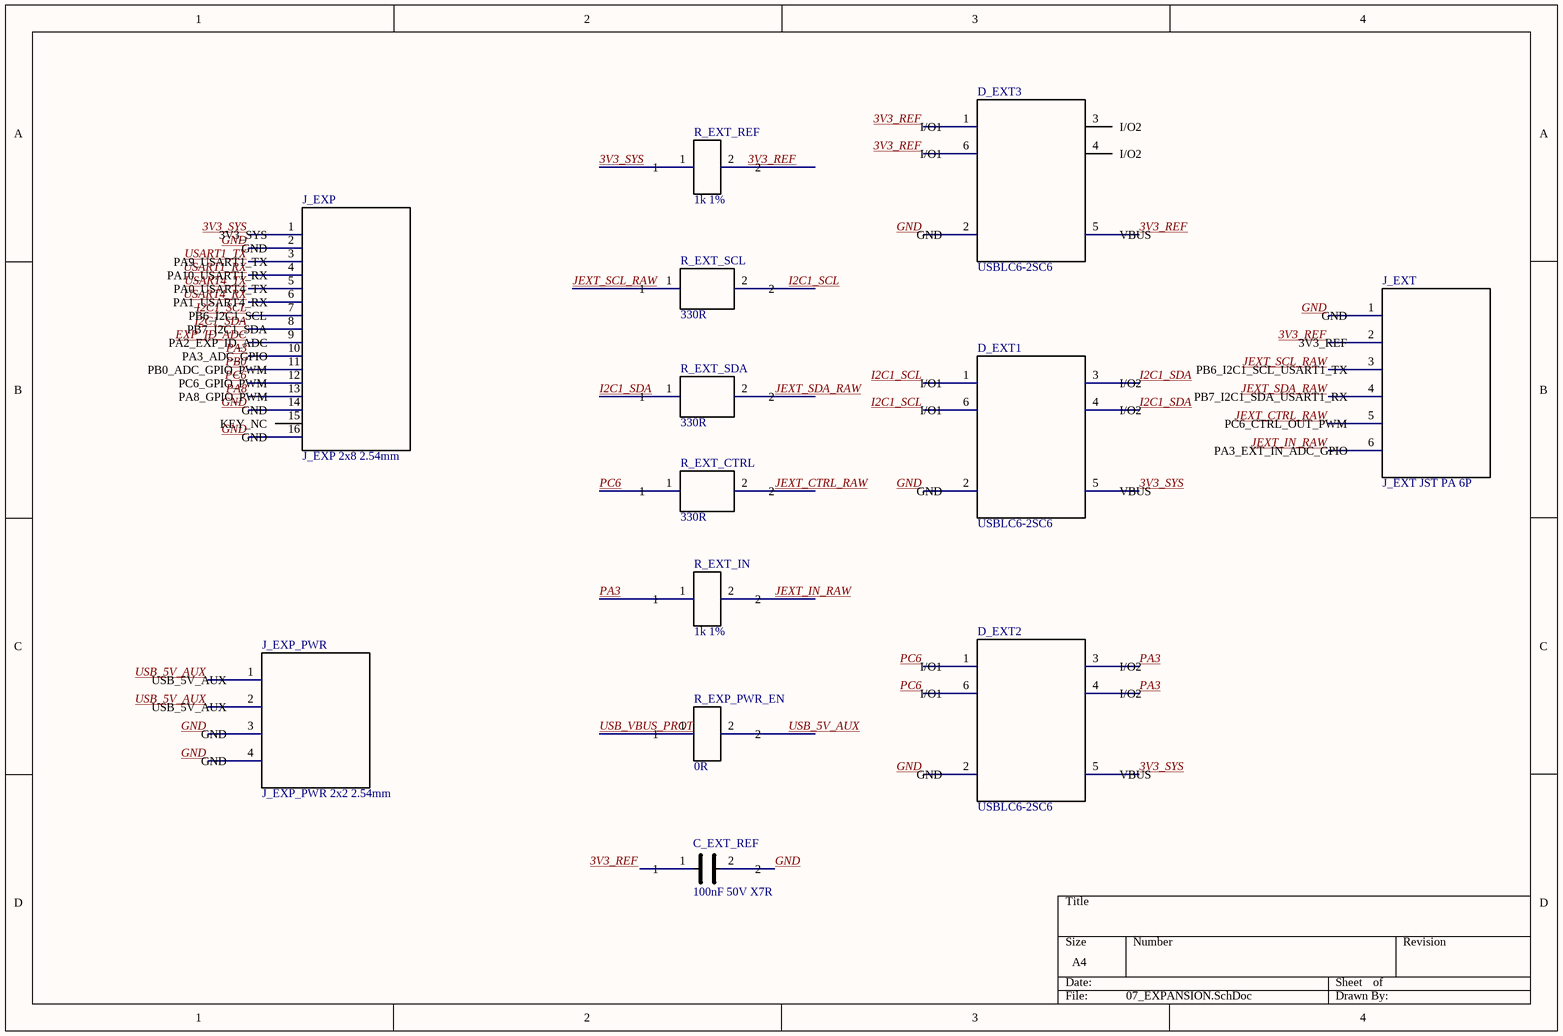
[diagram p6: 07_EXPANSION.SchDoc]

### Parts
C_EXT_REF  100nF 50V X7R  [SAMSUNG_CL10_0603_CAP_2P]
D_EXT1  USBLC6-2SC6  [ST_SOT23_6L_USBLC6_6P]
D_EXT2  USBLC6-2SC6  [ST_SOT23_6L_USBLC6_6P]
D_EXT3  USBLC6-2SC6  [ST_SOT23_6L_USBLC6_6P]
J_EXP  J_EXP 2x8 2.54mm  [GENERIC_HEADER_2X8_P2P54_THT]
J_EXP_PWR  J_EXP_PWR 2x2 2.54mm  [GENERIC_HEADER_2X2_P2P54_THT]
J_EXT  J_EXT JST PA 6P  [JST_PA_B06B_PASK_1N_6P_THT]
R_EXP_PWR_EN  0R  [RES_0603_SHARED_2P]
R_EXT_CTRL  330R  [RES_0603_SHARED_2P]
R_EXT_IN  1k 1%  [RES_0805_SHARED_2P]
R_EXT_REF  1k 1%  [RES_0805_SHARED_2P]
R_EXT_SCL  330R  [RES_0603_SHARED_2P]
R_EXT_SDA  330R  [RES_0603_SHARED_2P]

### Nets
GND: C_EXT_REF.2 D_EXT1.2(GND) D_EXT2.2(GND) D_EXT3.2(GND) J_EXP.2(GND) J_EXP.14(GND) J_EXP.16(GND) J_EXP_PWR.3(GND) J_EXP_PWR.4(GND) J_EXT.1(GND)
3V3_REF: C_EXT_REF.1 D_EXT3.1(I/O1) D_EXT3.5(VBUS) D_EXT3.6(I/O1) J_EXT.2(3V3_REF) R_EXT_REF.2
3V3_SYS: D_EXT1.5(VBUS) D_EXT2.5(VBUS) J_EXP.1(3V3_SYS) R_EXT_REF.1
EXP_ID_ADC: J_EXP.9(PA2_EXP_ID_ADC)
I2C1_SCL: D_EXT1.1(I/O1) D_EXT1.6(I/O1) J_EXP.7(PB6_I2C1_SCL) R_EXT_SCL.2
I2C1_SDA: D_EXT1.3(I/O2) D_EXT1.4(I/O2) J_EXP.8(PB7_I2C1_SDA) R_EXT_SDA.1
JEXT_CTRL_RAW: J_EXT.5(PC6_CTRL_OUT_PWM) R_EXT_CTRL.2
JEXT_IN_RAW: J_EXT.6(PA3_EXT_IN_ADC_GPIO) R_EXT_IN.2
JEXT_SCL_RAW: J_EXT.3(PB6_I2C1_SCL_USART1_TX) R_EXT_SCL.1
JEXT_SDA_RAW: J_EXT.4(PB7_I2C1_SDA_USART1_RX) R_EXT_SDA.2
PA3: D_EXT2.3(I/O2) D_EXT2.4(I/O2) J_EXP.10(PA3_ADC_GPIO) R_EXT_IN.1
PA8: J_EXP.13(PA8_GPIO_PWM)
PB0: J_EXP.11(PB0_ADC_GPIO_PWM)
PC6: D_EXT2.1(I/O1) D_EXT2.6(I/O1) J_EXP.12(PC6_GPIO_PWM) R_EXT_CTRL.1
USART1_RX: J_EXP.4(PA10_USART1_RX)
USART1_TX: J_EXP.3(PA9_USART1_TX)
USART4_RX: J_EXP.6(PA1_USART4_RX)
USART4_TX: J_EXP.5(PA0_USART4_TX)
USB_5V_AUX: J_EXP_PWR.1(USB_5V_AUX) J_EXP_PWR.2(USB_5V_AUX) R_EXP_PWR_EN.2
USB_VBUS_PROT: R_EXP_PWR_EN.1

Not connected (* = marked no-connect by the designer): D_EXT3 3(I/O2) 4(I/O2); J_EXP 15(KEY_NC)

### Library data of the parts
C_EXT_REF = CL10B104KB8NNNC: as C_MCU_HF on sheet 02_MCU_CORE; MPN: CL10B104KB8NNNC; Value: 100nF 50V X7R; Package: 0603 / 1608 metric; Datasheet: https://product.samsungsem.com/mlcc/CL10B104KB8NNN.do
D_EXT1-D_EXT3 = USBLC6-2SC6: as D_ESD1 on sheet 03_MICROSD; MPN: USBLC6-2SC6; Value: USBLC6-2SC6; Package: SOT23-6L; Datasheet: https://www.st.com/resource/en/datasheet/usblc6-2.pdf; PIN_FUNCTION_SOURCE: MANUFACTURER_DATASHEET
J_EXP = J_EXP_2X8_MALE_P2P54_THT: Internal rigid daughterboard expansion header; generic 2x8 male vertical THT; position 15 is KEY/NC and metal pin 15 shall be physically removed; MPN: 2X8-MALE-P2P54-THT; Procurement: Iran generic 2.54mm double-row male header; Lion PLD-2.54-2X40GF may be cut to 2x8; equivalent allowed; Mechanical_Key: POSITION_15_NO_METAL_PIN; mating female cavity 15 shall be blocked; Source_Baseline: T21_EXPANSION_DECISIONS_2026-08-28 + Expansion Architecture RevA v1.0; Design_Status: T21_LOCK; Qualification_Status: GENERIC_GEOMETRY_LOCKED_PHYSICAL_SAMPLE_FIT_PENDING; PIN_NUMBER_SOURCE: PROJECT_PHYSICAL_NUMBERING_LOCK_T21; PIN_FUNCTION_SOURCE: EXPANSION_ARCHITECTURE_REVA_V1.0_PLUS_T21_DECISIONS; Manufacturer: GENERIC; Value: J_EXP 2x8 2.54mm; Package: THT 2x8 pitch 2.54 mm
J_EXP_PWR = J_EXP_PWR_2X2_MALE_P2P54_THT: Internal daughterboard auxiliary power header; USB_5V_AUX output-only; valid only with rigid J_EXP mating so J_EXP key enforces orientation; Manufacturer: GENERIC; MPN: 2X2-MALE-P2P54-THT; Procurement: Iran generic 2.54mm double-row male header; cut from longer strip allowed; Usage_Policy: RIGID_DAUGHTERBOARD_ONLY; NOT_FOR_STANDALONE_CABLE; OUTPUT_ONLY; NO_BACKFEED; Source_Baseline: T21_EXPANSION_DECISIONS_2026-08-28 + Expansion Architecture RevA v1.0; Design_Status: T21_LOCK; Qualification_Status: GENERIC_GEOMETRY_LOCKED; PIN_NUMBER_SOURCE: PROJECT_PHYSICAL_NUMBERING_LOCK_T21; PIN_FUNCTION_SOURCE: EXPANSION_ARCHITECTURE_REVA_V1.0; Value: J_EXP_PWR 2x2 2.54mm; Package: THT 2x2 pitch 2.54 mm
J_EXT = B06B-PASK-1N: Protected external signal expansion port; JST PA 6-pin top-entry THT with boss; external modules are self-powered except low-current 3V3_REF; Value: JST PA 6P 2.0mm; Mating_Housing: PAP-06V-S; Port_Policy: SIGNAL_PORT; EXTERNAL_MODULES_SELF_POWERED; PIN2_3V3_REF_NOT_POWER_OUTPUT; Source_Baseline: T21_EXPANSION_DECISIONS_2026-08-28 + JST official PA family; Design_Status: T21_LOCK; Qualification_Status: MECHANICAL_DATASHEET_LOCKED_PHYSICAL_SAMPLE_FIT_PENDING; PIN_NUMBER_SOURCE: JST_CIRCUIT_NUMBERING; PIN_FUNCTION_SOURCE: T21_JEXT_SIGNAL_PORT_LOCK_2026-08-28; Manufacturer: JST; MPN: B06B-PASK-1N; Package: PA family top-entry N type THT with boss, 6 circuits, 2.0 mm pitch; Datasheet: JST PA FAMILY ePA-F.pdf; B06B-PASK-1N
R_EXP_PWR_EN = SER0603J0R: as R_MODE on sheet 01_POWER; MPN: SER0603J0R; Value: 0R; Package: 0603; Datasheet: SER0603J0R-VO-Sub-Brand-(ER).pdf
R_EXT_CTRL R_EXT_SCL R_EXT_SDA = 0603WAF3300T5E: External-port series resistor; 330 ohm 1% 100mW 0603; Manufacturer: UNI-ROYAL; Value: 330R 1%; Source_Baseline: T21_JEXT_PROTECTION_LOCK_2026-08-28; Design_Status: T21_LOCK; Qualification_Status: CONTROLLED; PIN_NUMBER_SOURCE: INTERNAL_CONVENTION; PIN_FUNCTION_SOURCE: PASSIVE_RESISTOR; MPN: 0603WAF3300T5E; Package: 0603; Power: 100mW; Datasheet: UNI-ROYAL 0603WAF3300T5E / LCSC C23138
R_EXT_IN R_EXT_REF = 0805W8F1001T5E: as R_K1 on sheet 01_POWER; MPN: 0805W8F1001T5E; Value: 1k 1%; Package: 0805; Datasheet: UNI-ROYAL manufacturer resistor data